# EasyEDA Pro project EtherCAT-RK3506.epro, schematic RK3506, sheets 1 to 5 of 12

## Sheets
1 系统电源图: Board Name: Board1; Create Date: 2026-10-21; Page Name: 系统电源图; Project Name: EtherCAT-RK3506; Schematic Name: Schematic1; Update Date: 2026-10-21; Company: 嘉立创EDA; Page Size: A4; Version: V1.0
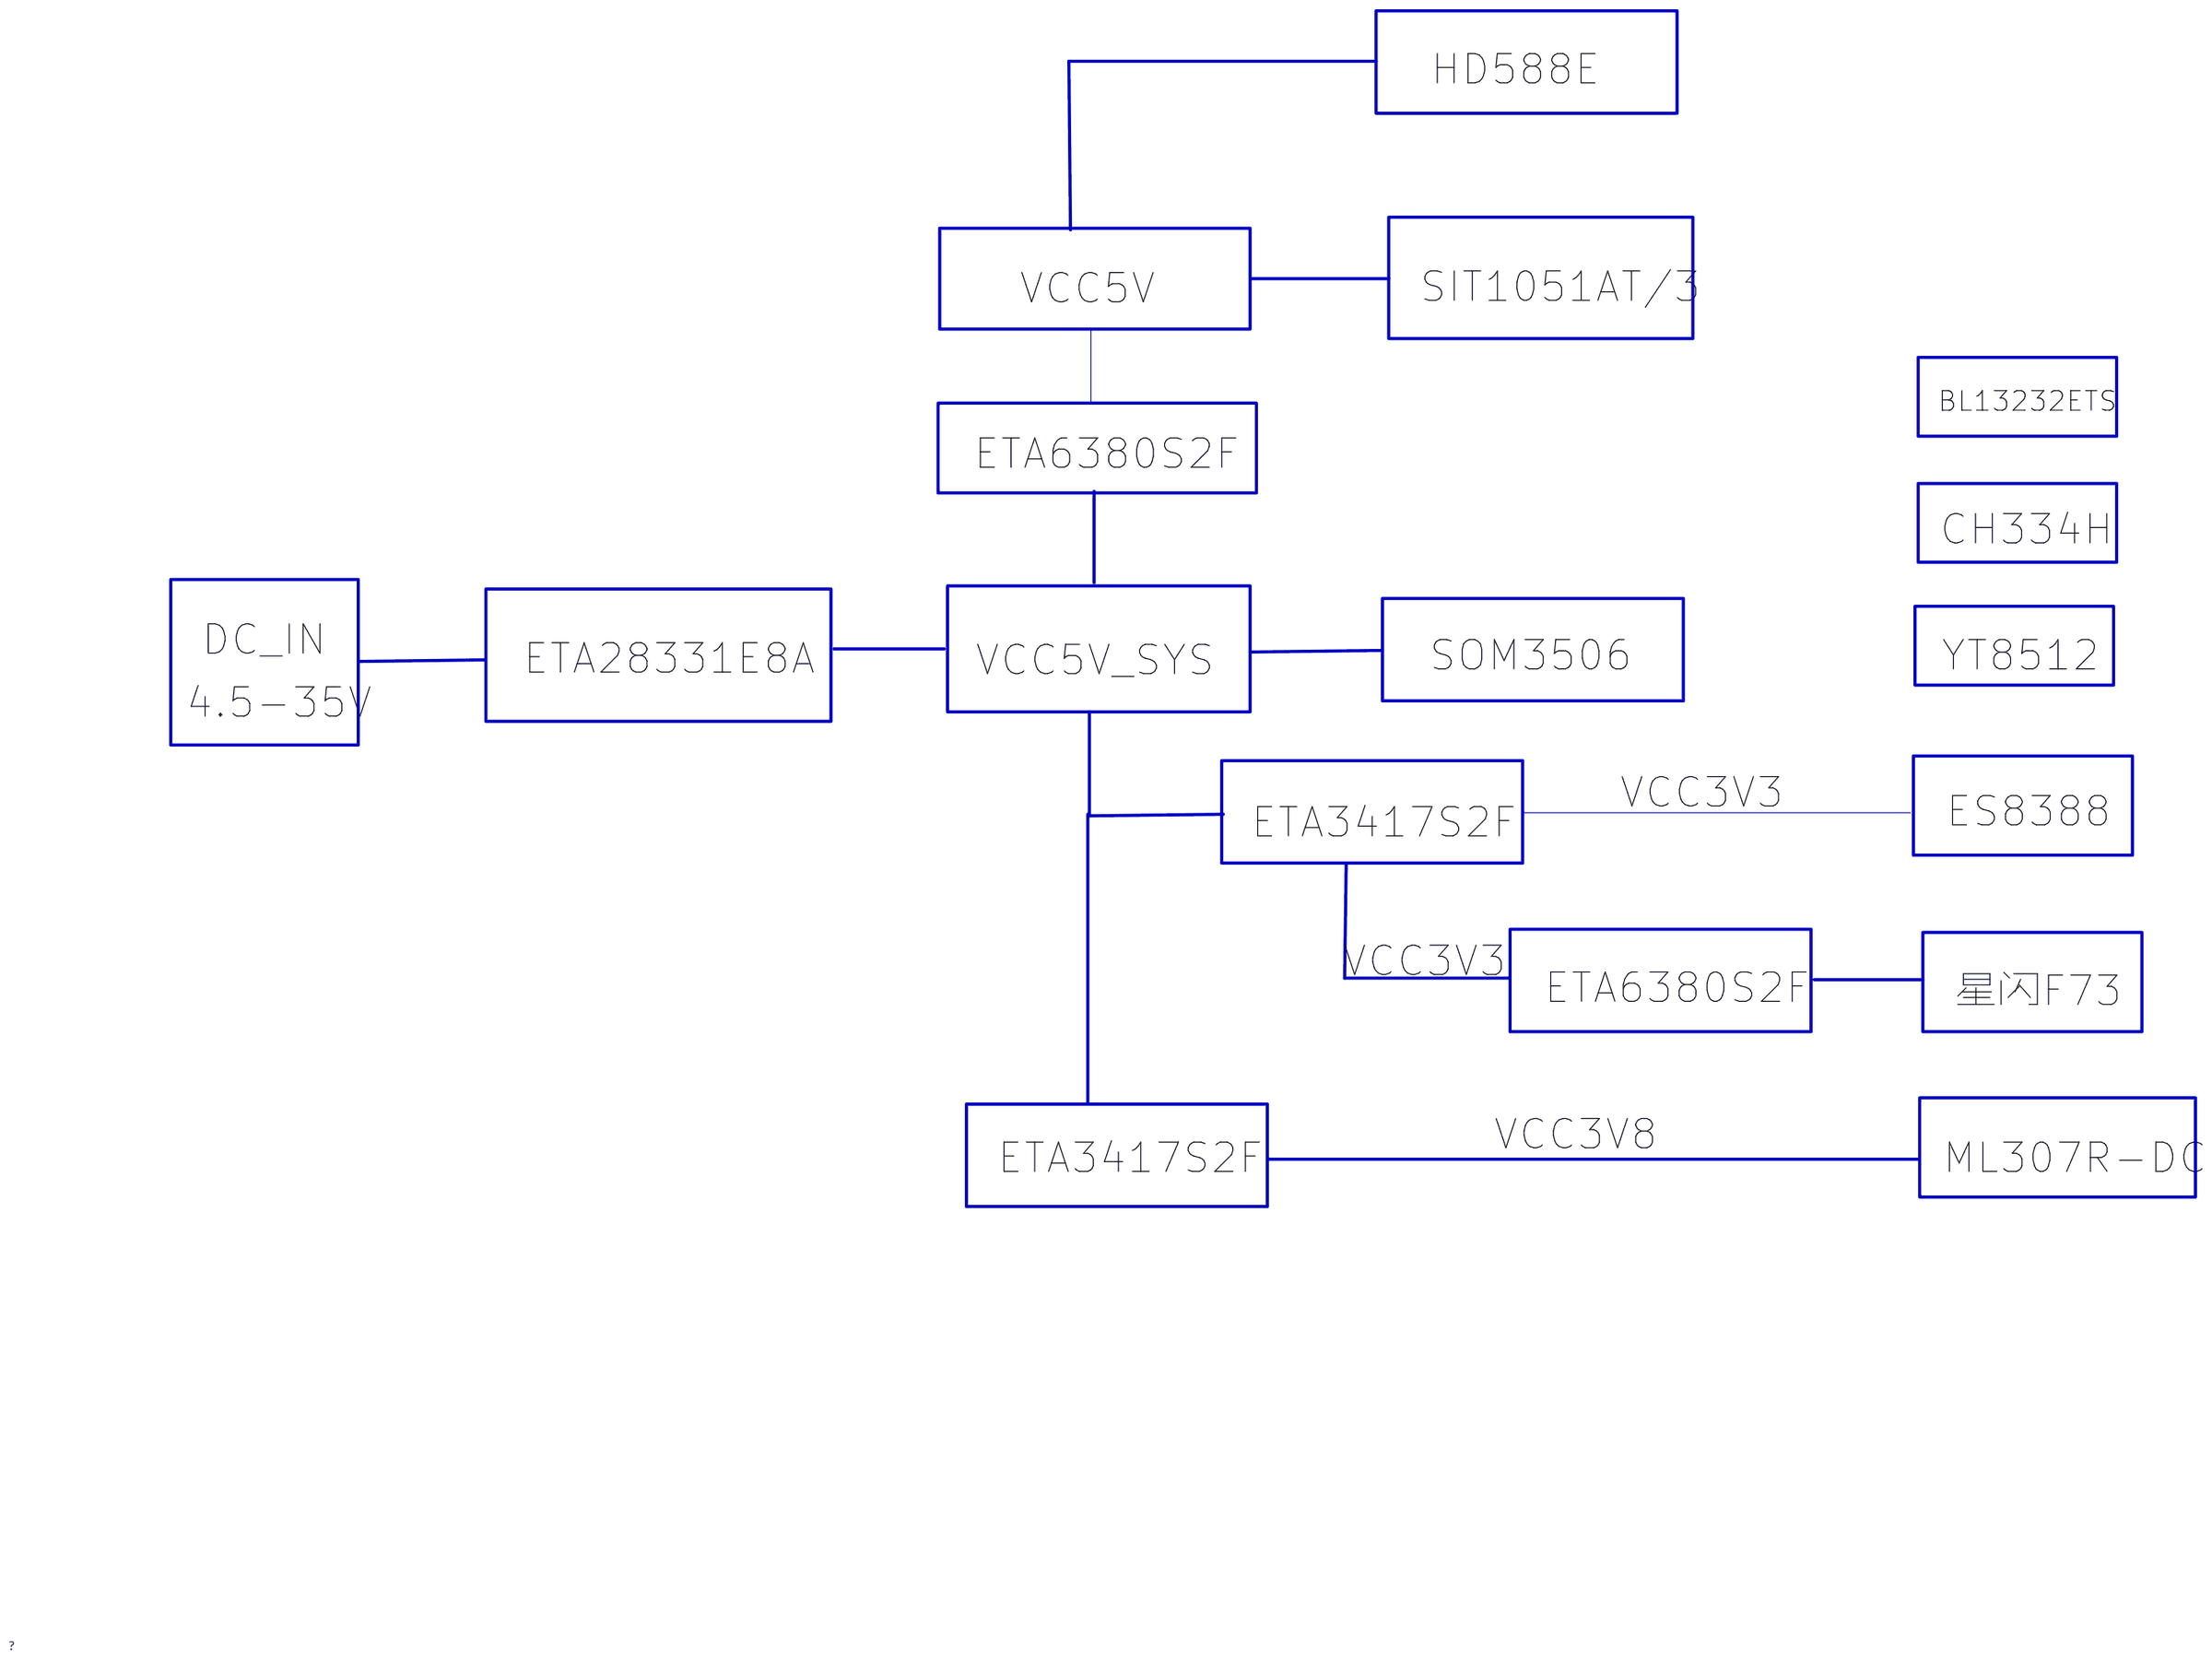
[diagram p0: 系统电源图]
2 系统功能图: Page Name: 系统功能图; Update Date: 2026-10-22
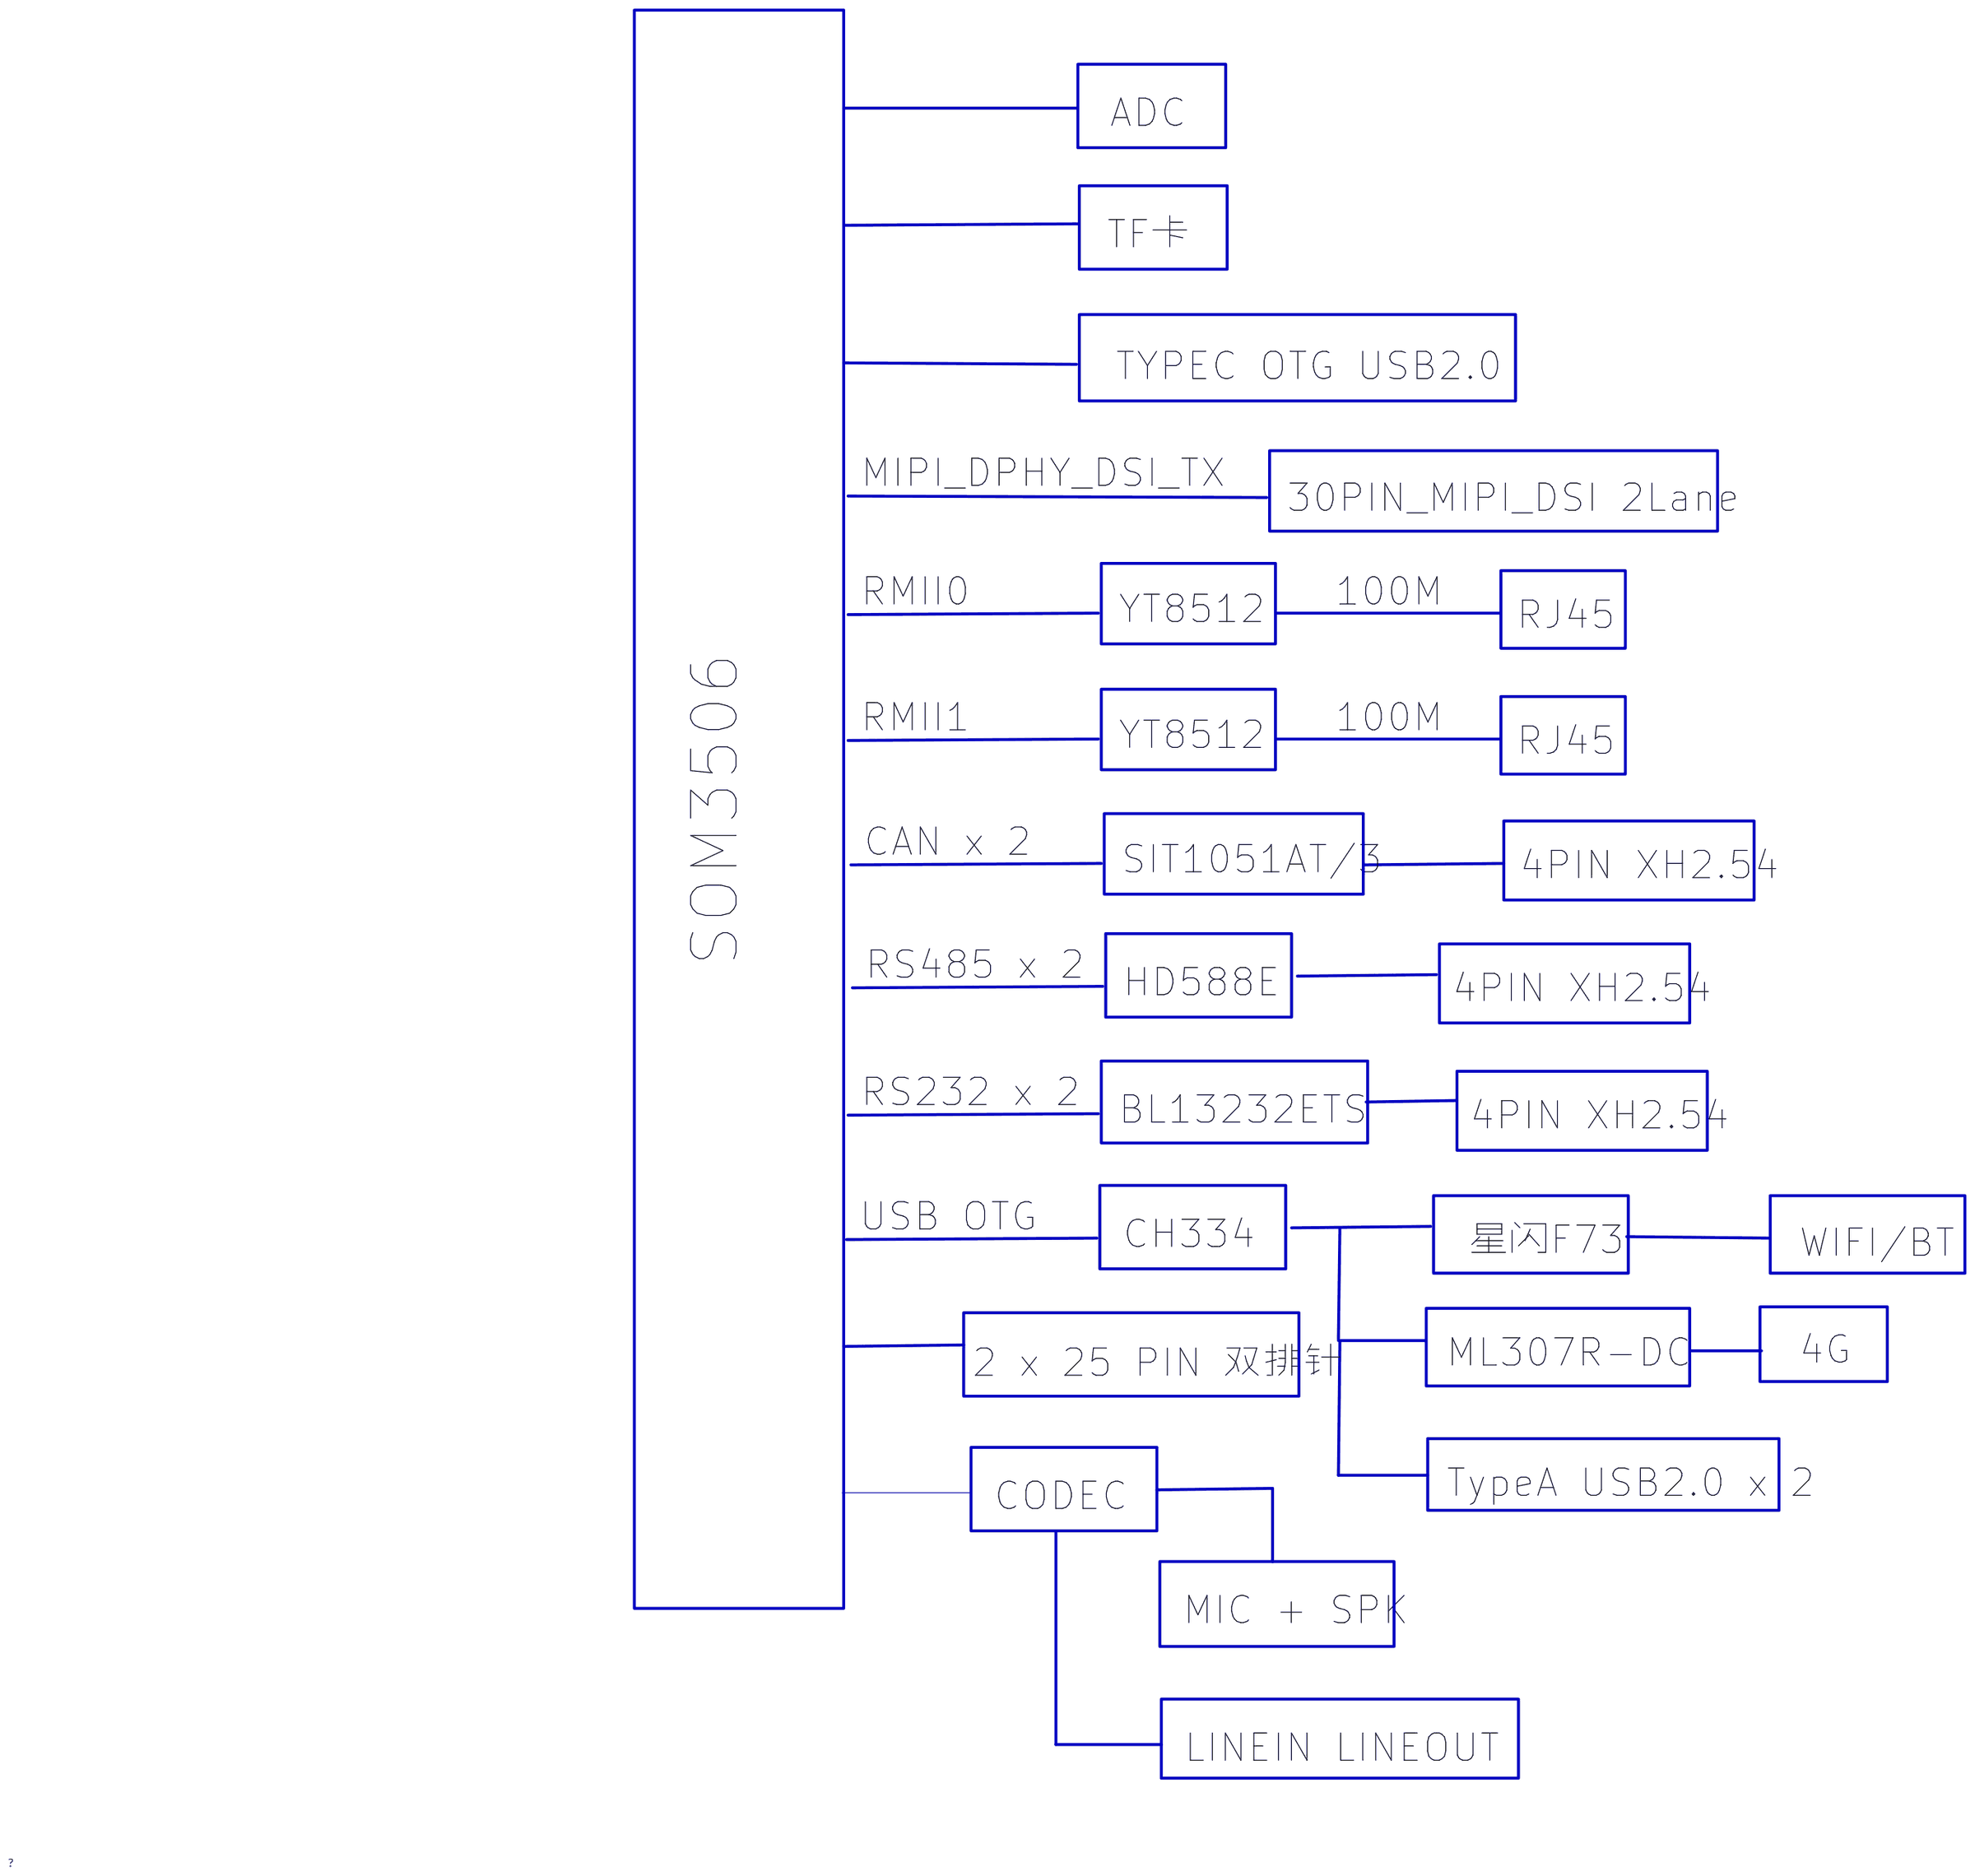
[diagram p1: 系统功能图]
3 电源: Page Name: 电源; Schematic Name: RK3506; Update Date: 2026-10-30
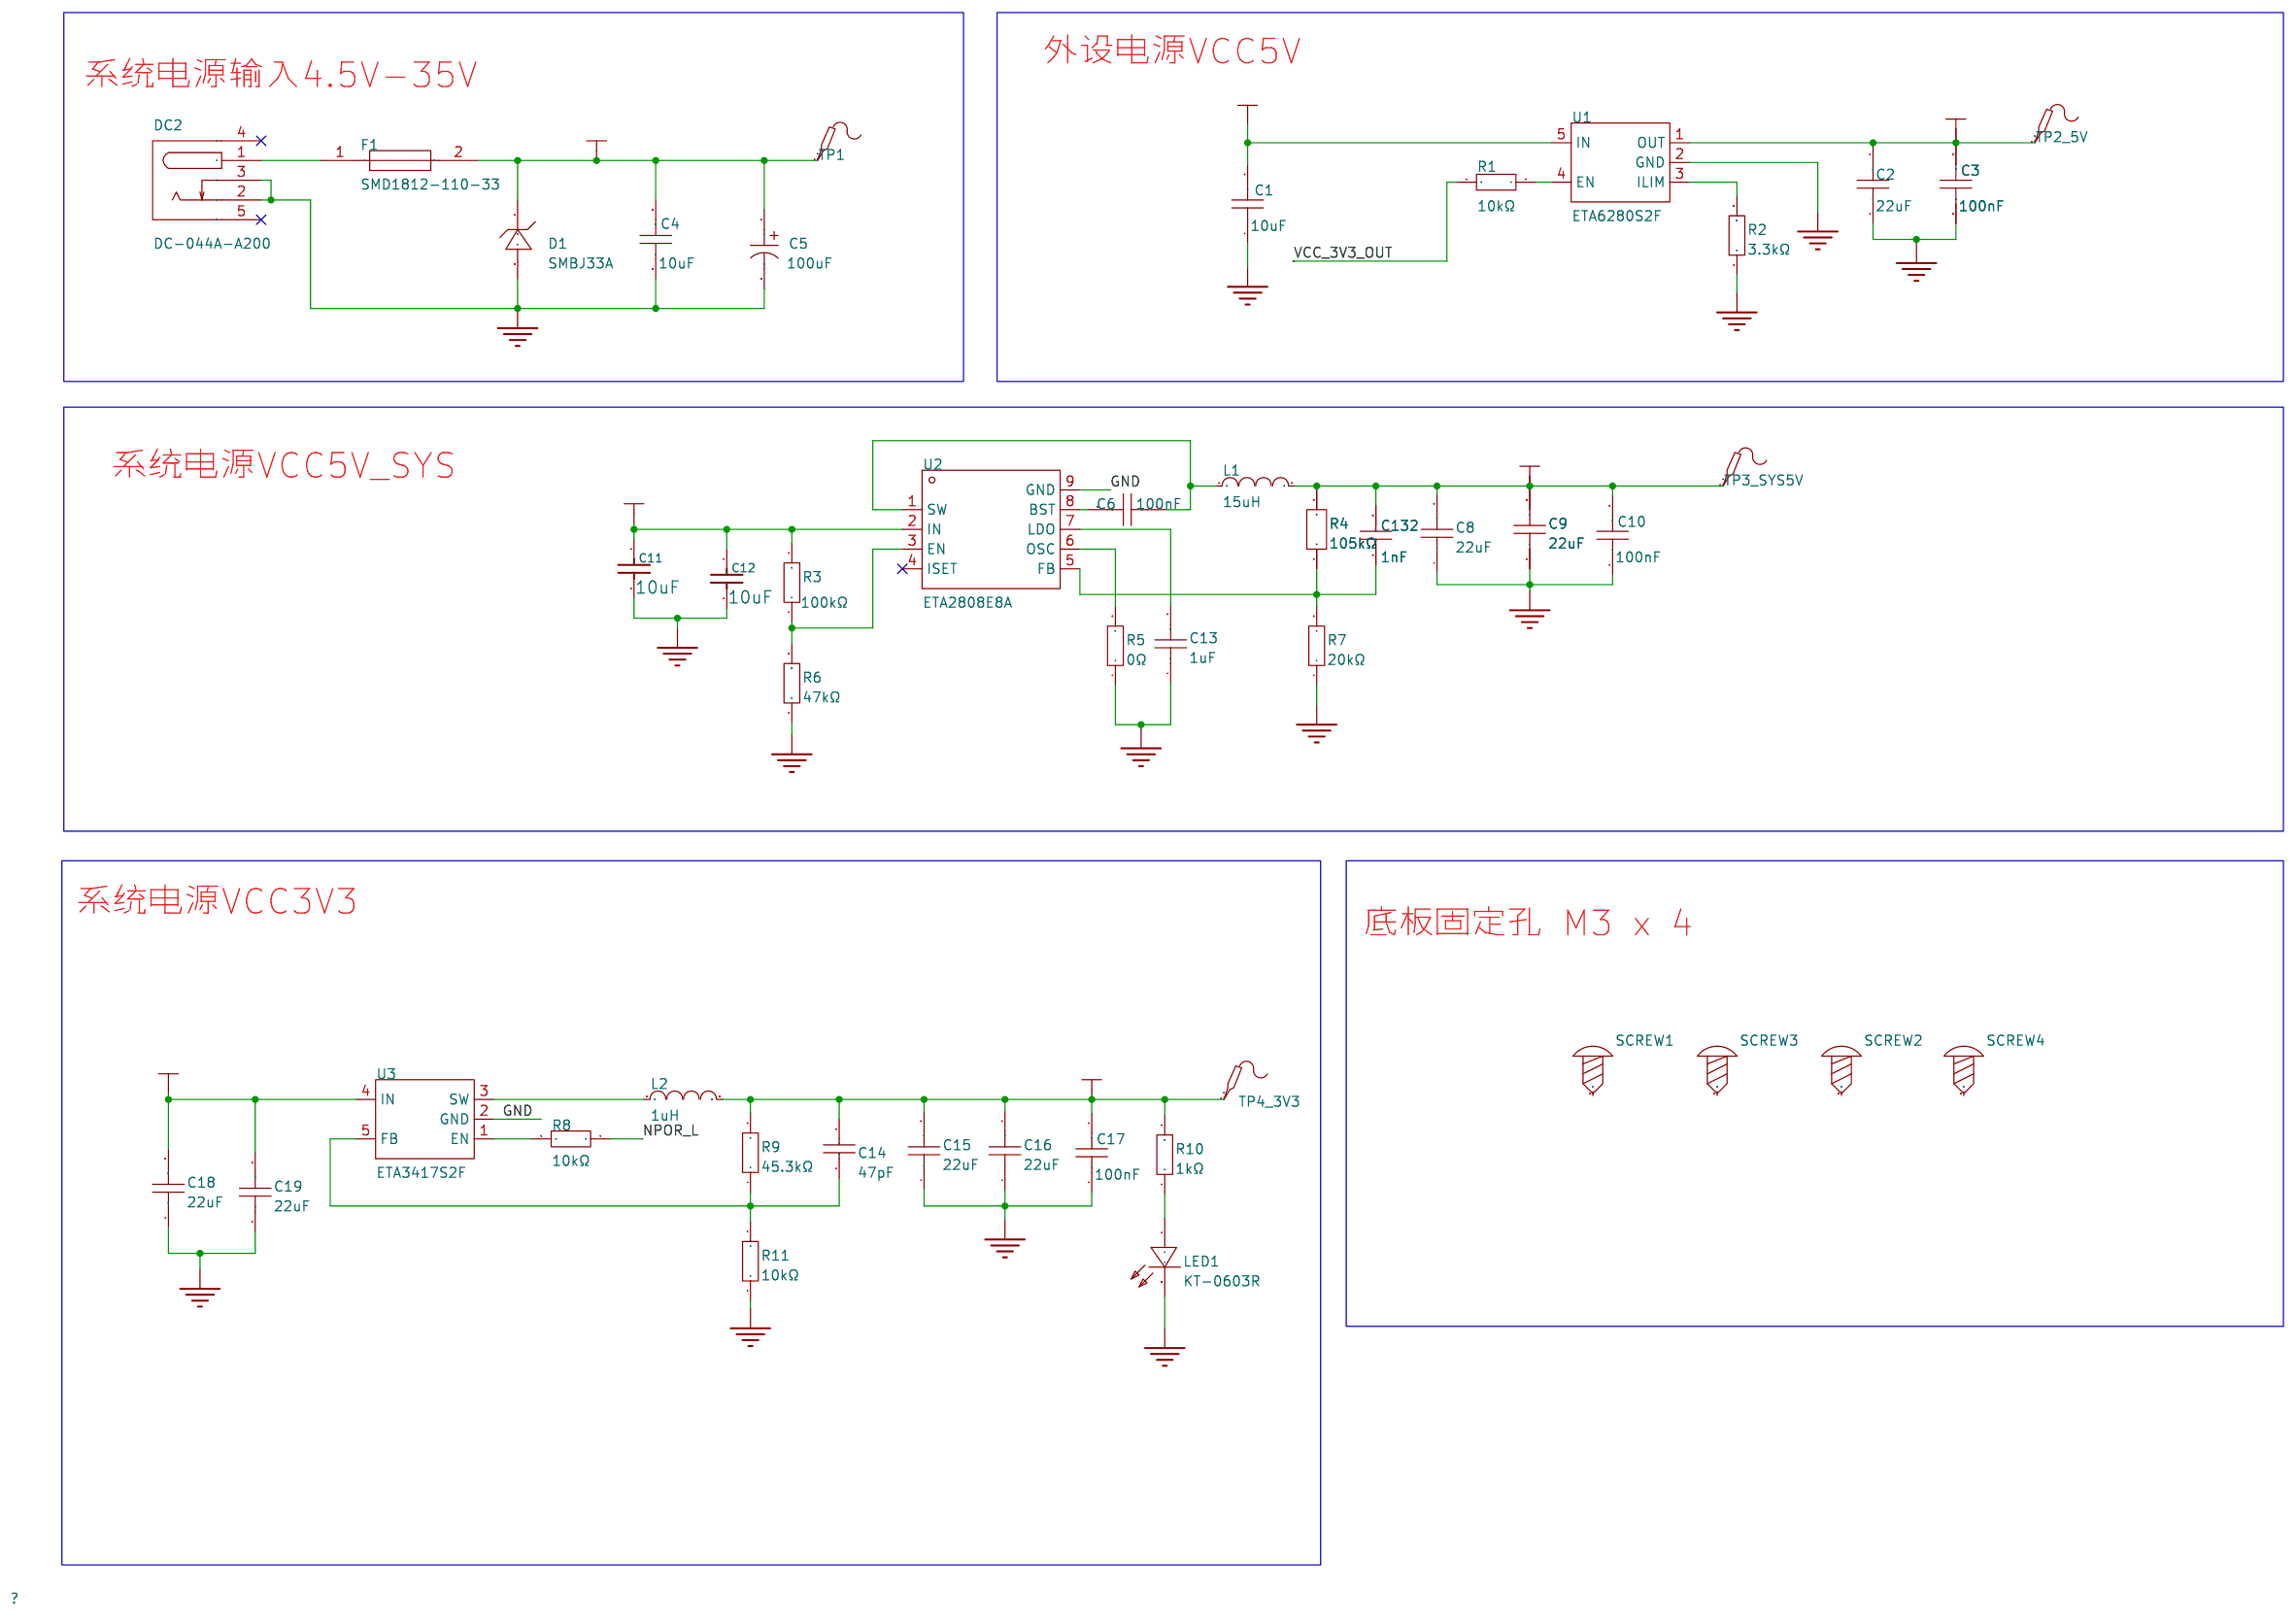
[diagram p2: 电源]
4 核心板: Create Date: 2026-10-22; Page Name: 核心板; Schematic Name: RK3506; Update Date: 2026-10-25
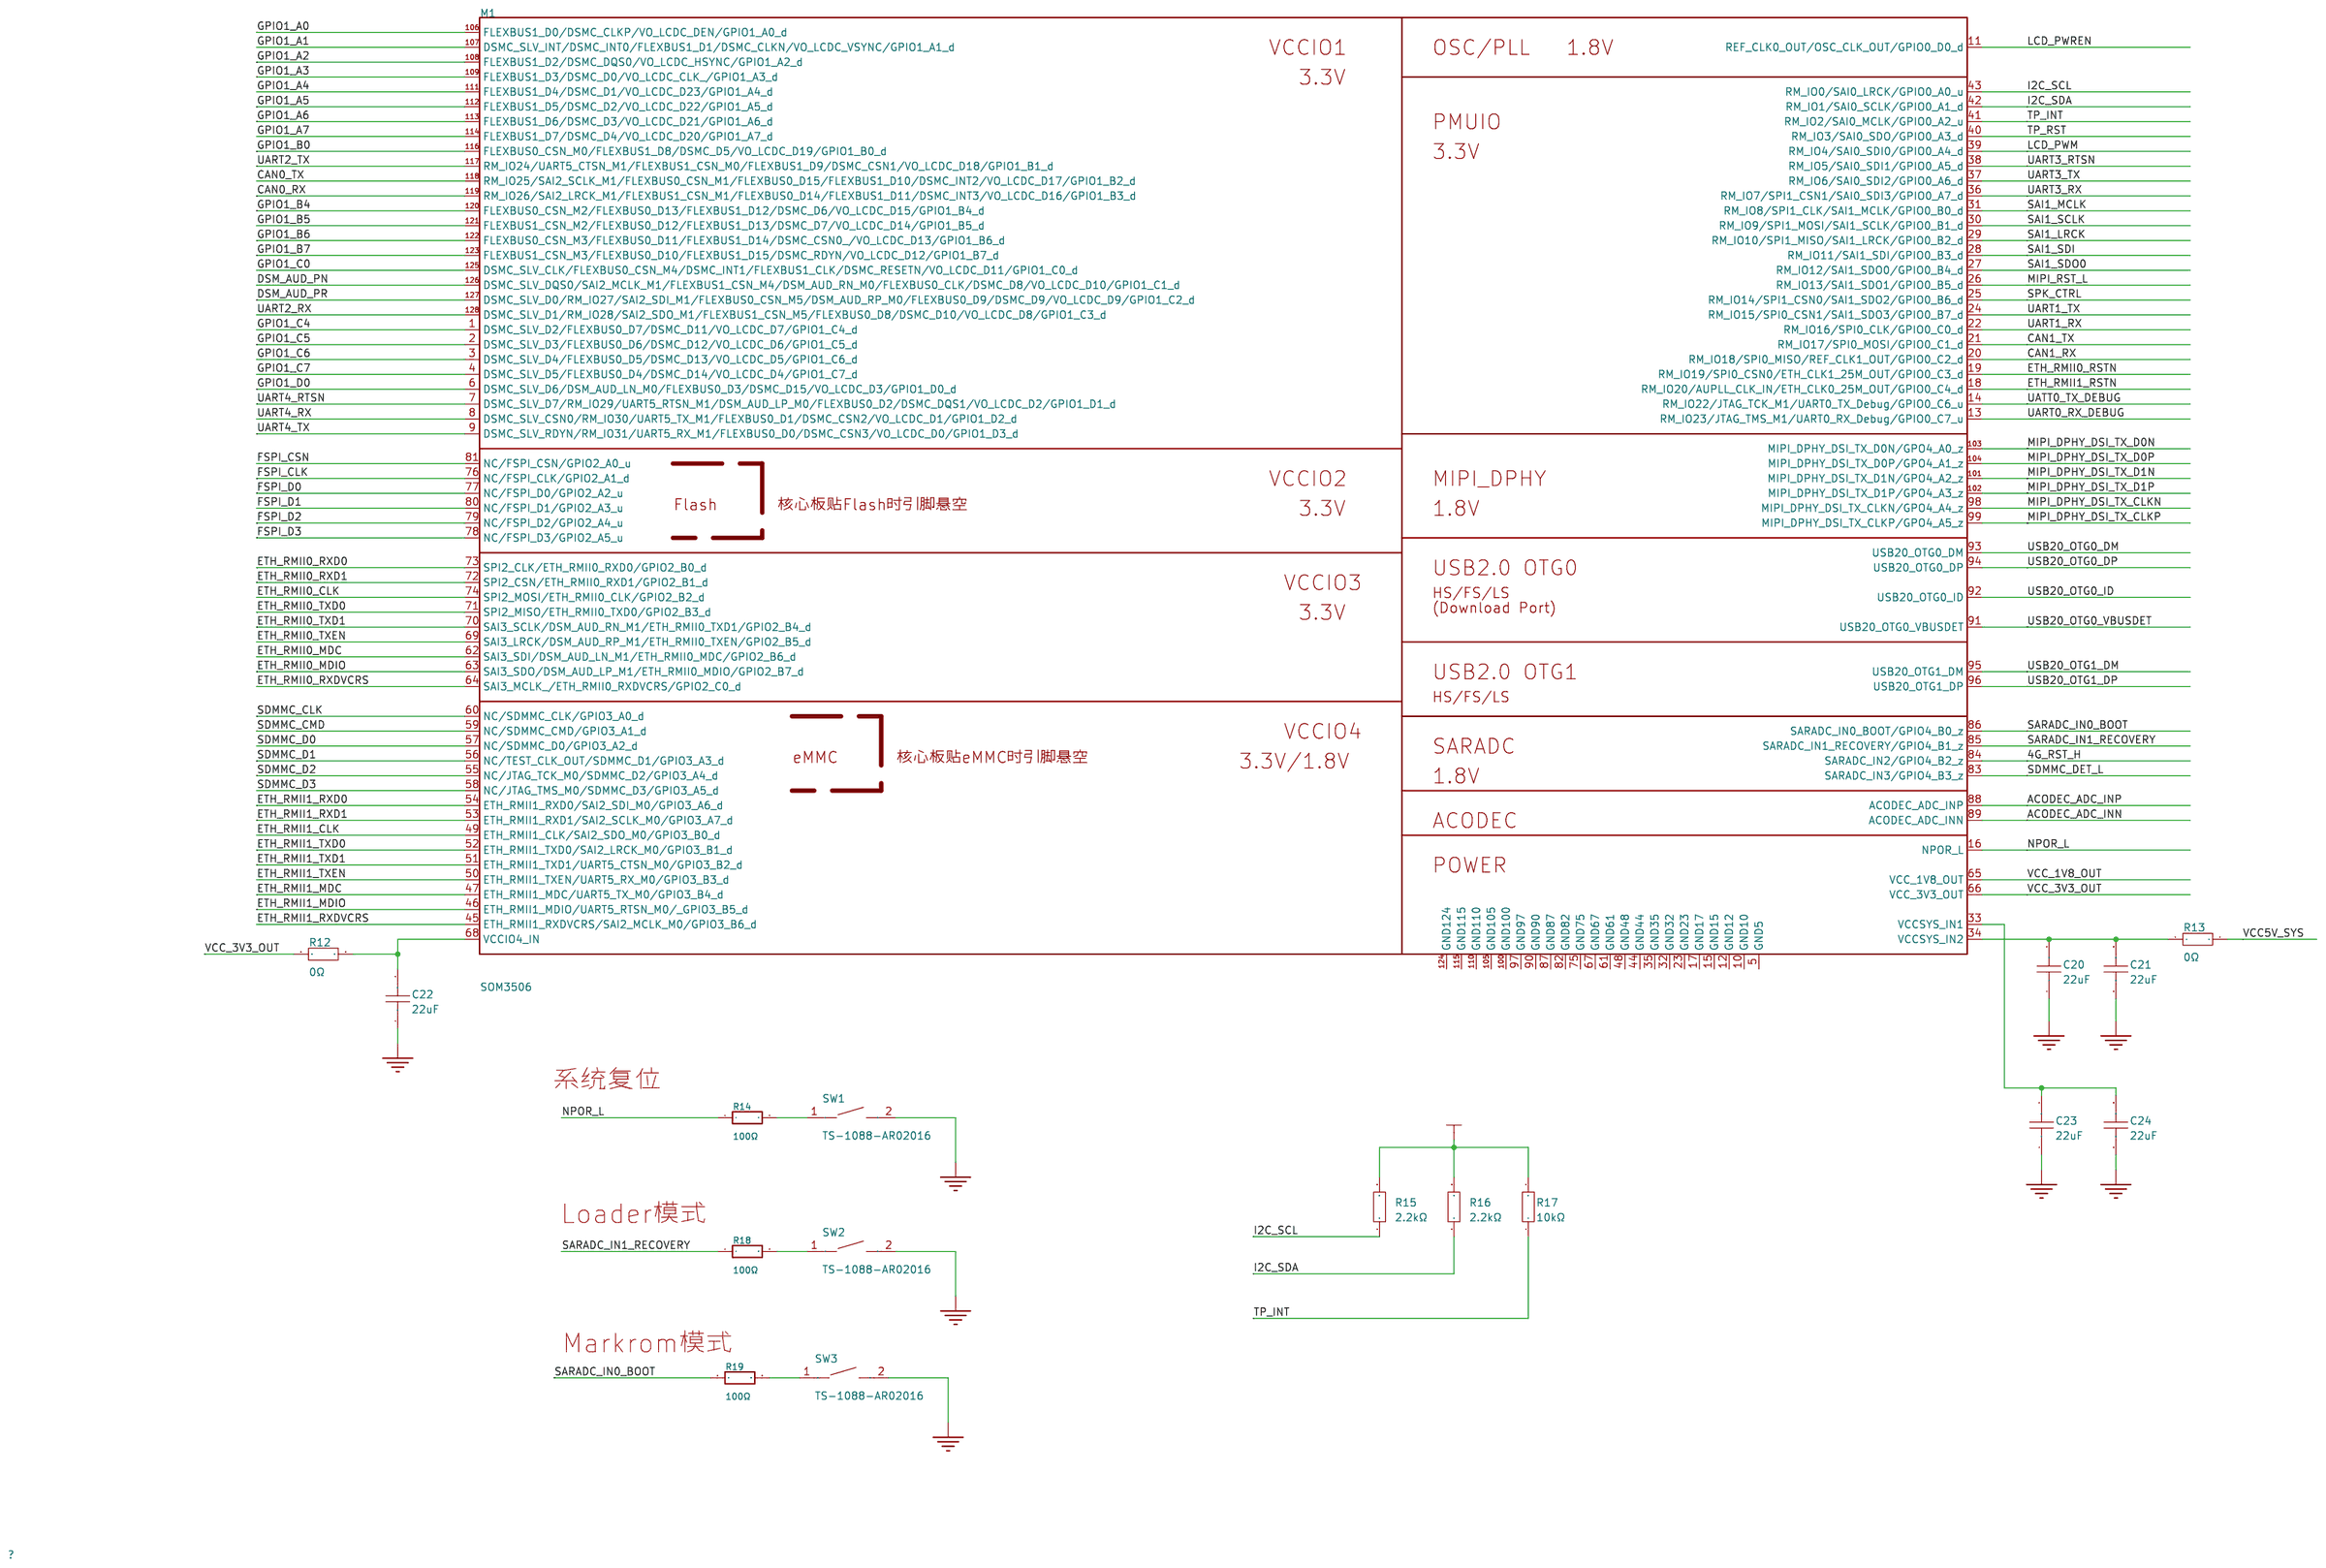
[diagram p3: 核心板]
5 以太网: Create Date: 2026-10-22; Page Name: 以太网; Schematic Name: RK3506; Update Date: 2026-10-28
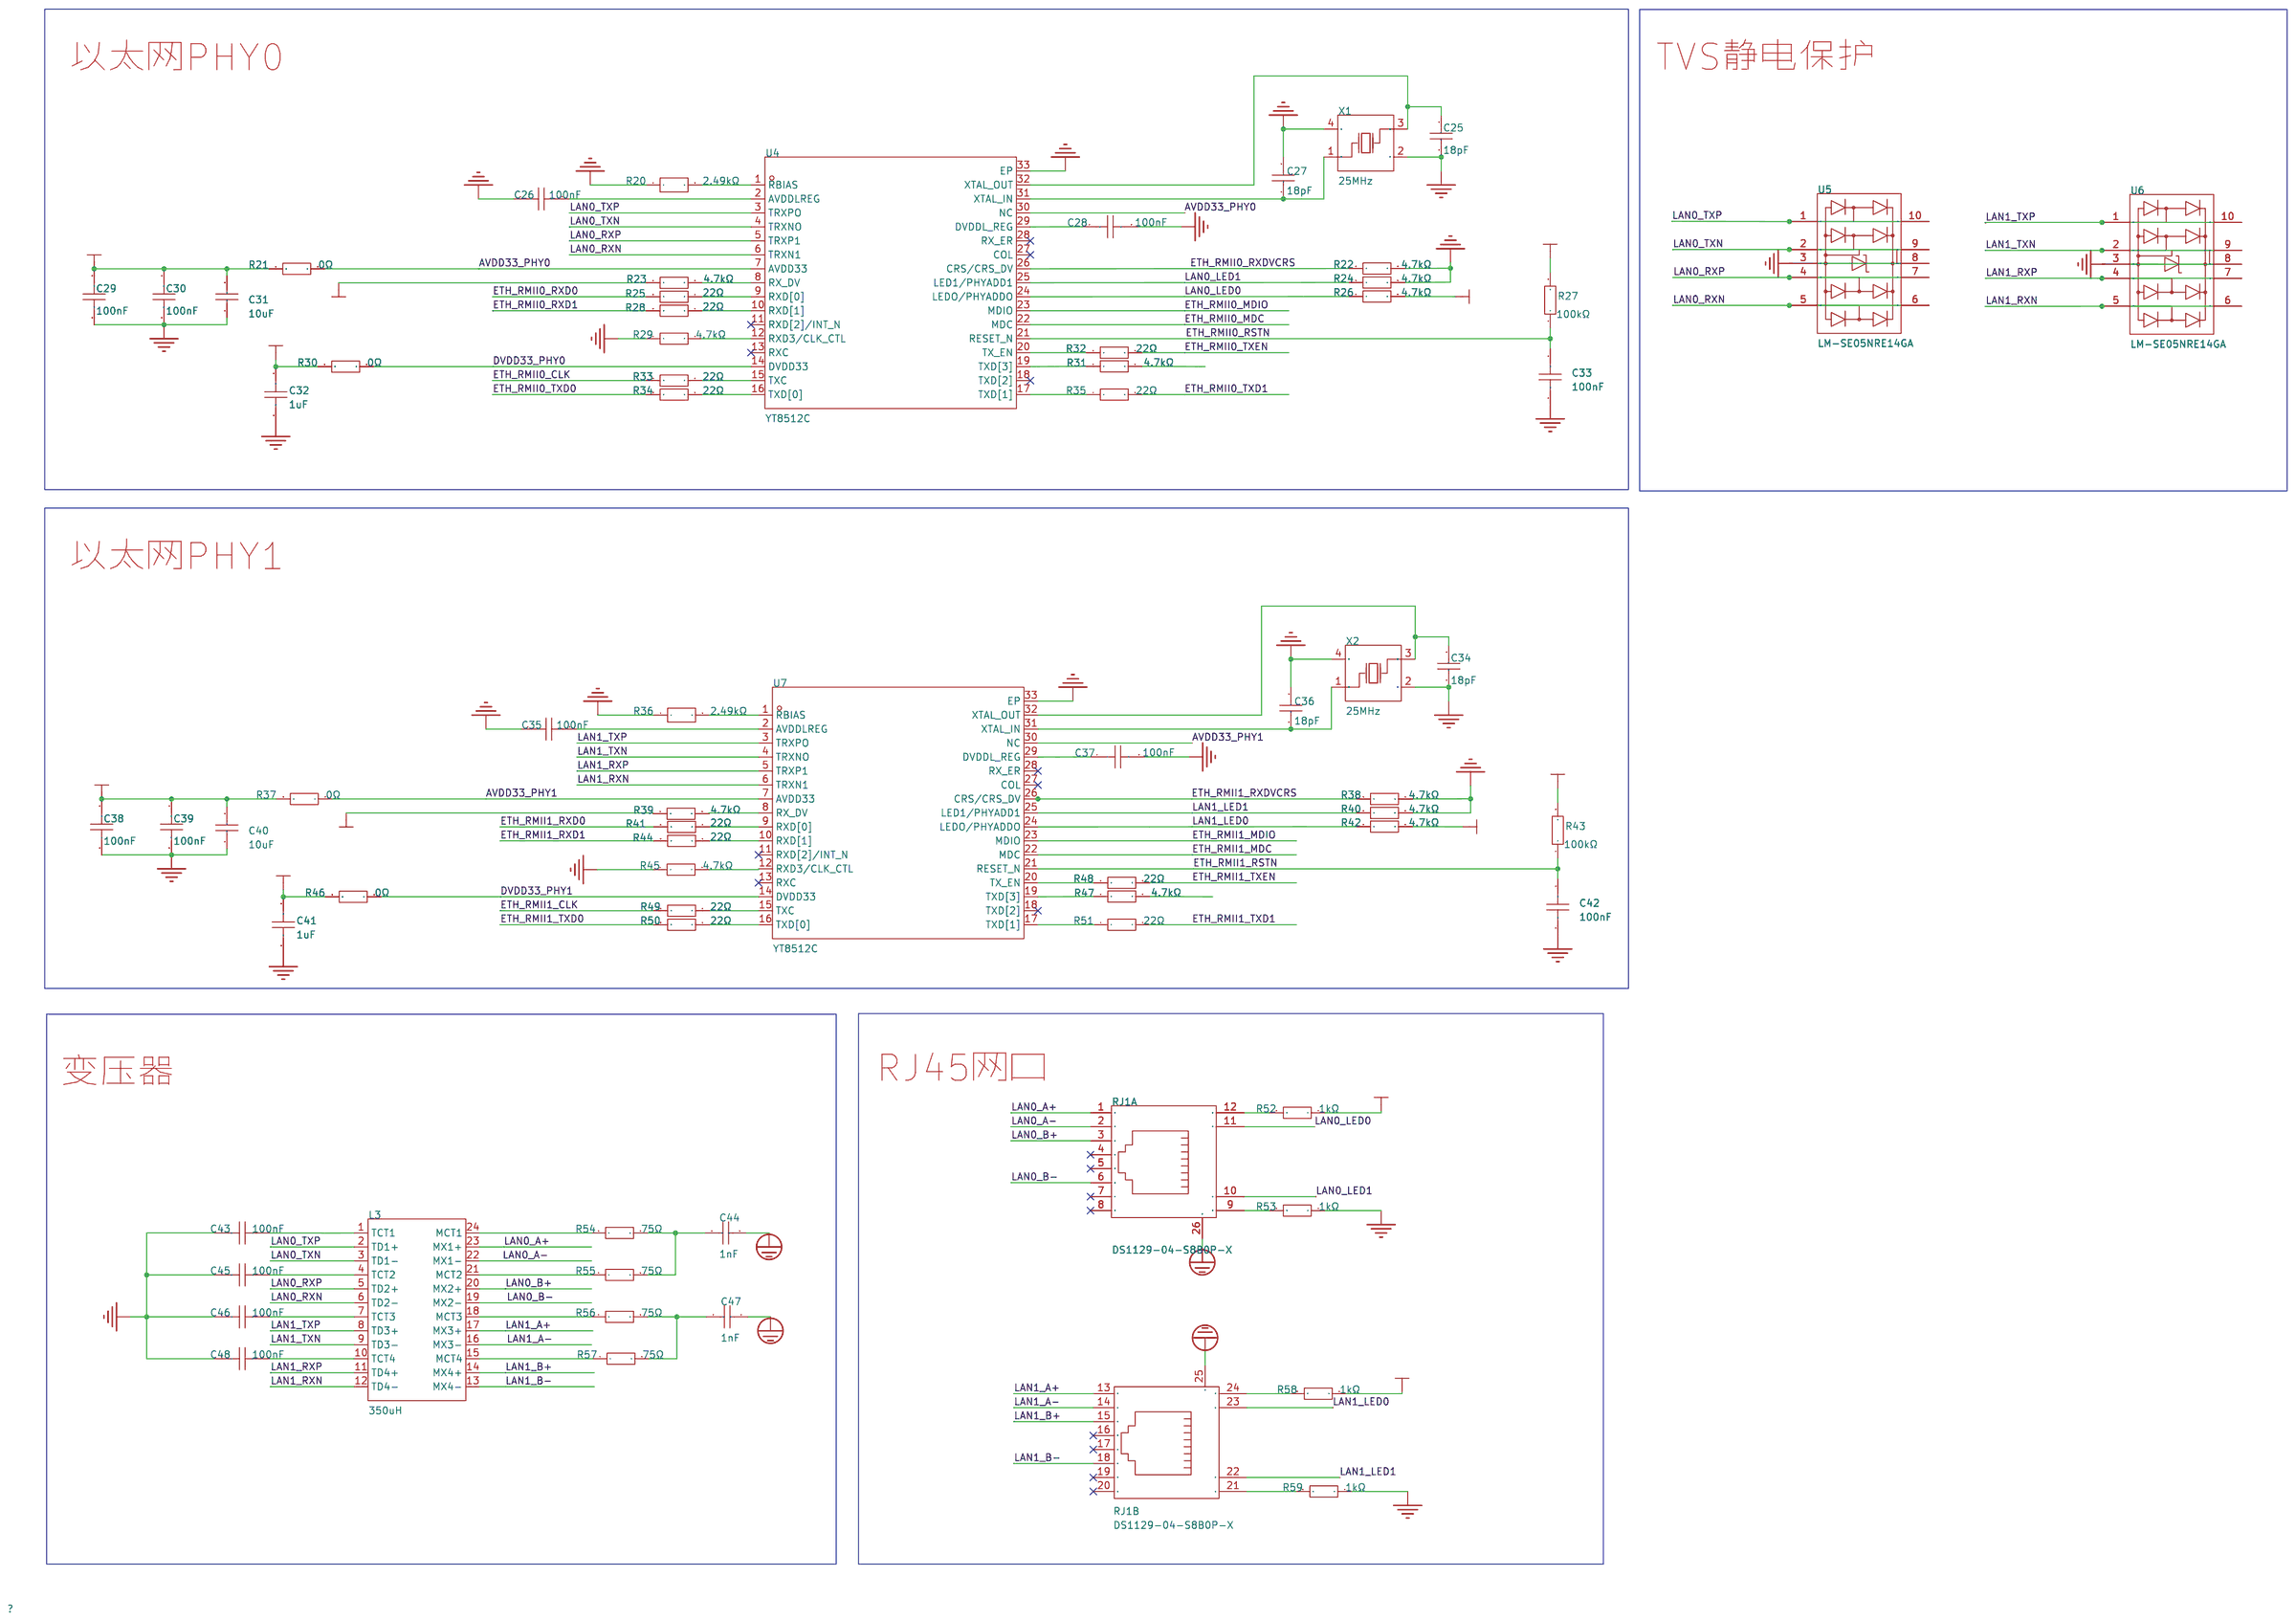
[diagram p4: 以太网]

## Parts
sheet 以太网
C25  18pF  [C0402]
C26  100nF  [C0402]
C27  18pF  [C0402]
C28  100nF  [C0402]
C29  100nF  [C0402]
C30  100nF  [C0402]
C31  10uF  [C0402]
C32  1uF  [C0402]
C33  100nF  [C0402]
C34  18pF  [C0402]
C35  100nF  [C0402]
C36  18pF  [C0402]
C37  100nF  [C0402]
C38  100nF  [C0402]
C39  100nF  [C0402]
C40  10uF  [C0402]
C41  1uF  [C0402]
C42  100nF  [C0402]
C43  100nF  [C0402]
C44  1nF  [C1206]
C45  100nF  [C0402]
C46  100nF  [C0402]
C47  1nF  [C1206]
C48  100nF  [C0402]
L3  350uH  [SMD-24_L15.1-W7.1-P1.00-LS10.0-BL]
R20  2.49kΩ  [R0402]
R21  0Ω  [R0402]
R22  4.7kΩ  [R0402]
R23  4.7kΩ  [R0402]
R24  4.7kΩ  [R0402]
R25  22Ω  [R0402]
R26  4.7kΩ  [R0402]
R27  100kΩ  [R0402]
R28  22Ω  [R0402]
R29  4.7kΩ  [R0402]
R30  0Ω  [R0402]
R31  4.7kΩ  [R0402]
R32  22Ω  [R0402]
R33  22Ω  [R0402]
R34  22Ω  [R0402]
R35  22Ω  [R0402]
R36  2.49kΩ  [R0402]
R37  0Ω  [R0402]
R38  4.7kΩ  [R0402]
R39  4.7kΩ  [R0402]
R40  4.7kΩ  [R0402]
R41  22Ω  [R0402]
R42  4.7kΩ  [R0402]
R43  100kΩ  [R0402]
R44  22Ω  [R0402]
R45  4.7kΩ  [R0402]
R46  0Ω  [R0402]
R47  4.7kΩ  [R0402]
R48  22Ω  [R0402]
R49  22Ω  [R0402]
R50  22Ω  [R0402]
R51  22Ω  [R0402]
R52  1kΩ  [R0402]
R53  1kΩ  [R0402]
R54  75Ω  [R0603]
R55  75Ω  [R0603]
R56  75Ω  [R0603]
R57  75Ω  [R0603]
R58  1kΩ  [R0402]
R59  1kΩ  [R0402]
RJ1  DS1129-04-S8B0P-X  [RJ45-TH_DS1129-04]  (sections 1,2)
U4  YT8512C  [QFN-32_L5.0-W5.0-P0.50-BL-EP3.4]
U5  LM-SE05NRE14GA  [DFN2510-10_L2.5-W1.0-P0.50-BL]
U6  LM-SE05NRE14GA  [DFN2510-10_L2.5-W1.0-P0.50-BL]
U7  YT8512C  [QFN-32_L5.0-W5.0-P0.50-BL-EP3.4]
X1  25MHz  [CRYSTAL-SMD_4P-L3.2-W2.5-BL]
X2  25MHz  [CRYSTAL-SMD_4P-L3.2-W2.5-BL]
sheet 核心板
C20  22uF  [C0402]
C21  22uF  [C0402]
C22  22uF  [C0402]
C23  22uF  [C0402]
C24  22uF  [C0402]
M1  SOM3506  [SOM3506_128P]
R12  0Ω  [R0402]
R13  0Ω  [R0402]
R14  100Ω  [R0402]
R15  2.2kΩ  [R0402]
R16  2.2kΩ  [R0402]
R17  10kΩ  [R0402]
R18  100Ω  [R0402]
R19  100Ω  [R0402]
SW1  TS-1088-AR02016  [SW-SMD_L3.9-W3.0-P4.45]
SW2  TS-1088-AR02016  [SW-SMD_L3.9-W3.0-P4.45]
SW3  TS-1088-AR02016  [SW-SMD_L3.9-W3.0-P4.45]
sheet 电源
C1  10uF  [C0603]
C2  22uF  [C0603]
C3  100nF  [C0402]
C4  10uF  [C1206]
C5  100uF  [CAP-SMD_BD6.3-L6.6-W6.6-RD]
C6  100nF  [C0402]
C8  22uF  [C0402]
C9  22uF  [C0402]
C10  100nF  [C0402]
C11  10uF  [C1206]
C12  10uF  [C1206]
C13  1uF  [C0402]
C14  47pF  [C0402]
C15  22uF  [C0402]
C16  22uF  [C0402]
C17  100nF  [C0402]
C18  22uF  [C0402]
C19  22uF  [C0402]
C132  1nF  [C0402]
D1  SMBJ33A  [SMB_L4.6-W3.6-LS5.3-RD]
DC2  DC-044A-A200  [DC-IN-TH_DC-044A-20A]
F1  SMD1812-110-33  [F1812]
L1  15uH  [IND-SMD_L7.3-W6.8]
L2  1uH  [L0806]
LED1  KT-0603R  [LED-SMD_L1.6-W0.8-R-RD]
R1  10kΩ  [R0402]
R2  3.3kΩ  [R0402]
R3  100kΩ  [R0402]
R4  105kΩ  [R0402]
R5  0Ω  [R0402]
R6  47kΩ  [R0402]
R7  20kΩ  [R0402]
R8  10kΩ  [R0402]
R9  45.3kΩ  [R0402]
R10  1kΩ  [R0402]
R11  10kΩ  [R0402]
SCREW1  -  [M3螺丝]
SCREW2  -  [M3螺丝]
SCREW3  -  [M3螺丝]
SCREW4  -  [M3螺丝]
TP1  -  [Test-Point-0.5mm]
TP2_5V  -  [Test-Point-0.5mm]
TP3_SYS5V  -  [Test-Point-0.5mm]
TP4_3V3  -  [Test-Point-0.5mm]
U1  ETA6280S2F  [SOT-23-5_L3.0-W1.5-P0.95-LS2.8-BL]
U2  ETA2808E8A  [ESOP-8_L4.9-W3.9-P1.27-LS6.0-BL-EP]
U3  ETA3417S2F  [SOT-23-5_L2.9-W1.6-P0.95-LS2.8-BL]

## Library data of the parts
C25 C27 C34 C36 = 0402CG180J500NT: 容值:18pF;精度:±5%;额定电压:50V;温度系数:C0G;; LCSC Part Name: 18pF ±5% 50V; Supplier Part: C1549; Manufacturer: FH(风华); Supplier Footprint: 0402; JLCPCB Part Class: 基础库; Datasheet: https://item.szlcsc.com/datasheet/0402CG180J500NT/1901.html; Supplier: LCSC; Tolerance: ±5%; Voltage Rating: 50V; Temperature Coefficient: C0G
C3 C6 C10 C17 C26 C28-C30 C33 C35 C37-C39 C42 C43 C45 C46 C48 = FCC0402B104K160AT: 容值:100nF;精度:±10%;额定电压:16V;温度系数:X7R;; LCSC Part Name: 100nF ±10% 16V; Supplier Part: C5137468; Manufacturer: FOJAN(富捷); Supplier Footprint: 0402; JLCPCB Part Class: 扩展库; Datasheet: https://item.szlcsc.com/datasheet/FCC0402B104K160AT/5746970.html; Supplier: LCSC; Tolerance: ±10%; Voltage Rating: 16V; Temperature Coefficient: X7R; Operating Temperature: -55℃~+125℃
C31 C40 = CL05A106MQ5NUNC: 容值:10uF;精度:±20%;额定电压:6.3V;温度系数:X5R;; LCSC Part Name: 10uF ±20% 6.3V; Supplier Part: C15525; Manufacturer: SAMSUNG(三星); Supplier Footprint: 0402; JLCPCB Part Class: 基础库; Datasheet: https://item.szlcsc.com/datasheet/CL05A106MQ5NUNC/16204.html; Supplier: LCSC; Tolerance: ±20%; Voltage Rating: 6.3V; Temperature Coefficient: X5R
C13 C32 C41 = CL05A105KA5NQNC: 容值:1uF;精度:±10%;额定电压:25V;温度系数:X5R;; LCSC Part Name: 1uF ±10% 25V; Supplier Part: C52923; Manufacturer: SAMSUNG(三星); Supplier Footprint: 0402; JLCPCB Part Class: 基础库; Datasheet: https://item.szlcsc.com/datasheet/CL05A105KA5NQNC/53938.html; Supplier: LCSC; Tolerance: ±10%; Voltage Rating: 25V; Temperature Coefficient: X5R
C44 C47 = 1206B102K202NT: 容值:1nF;精度:±10%;额定电压:2kV;温度系数:X7R;; LCSC Part Name: 1nF ±10% 2kV; Supplier Part: C9196; Manufacturer: FH(风华); Supplier Footprint: 1206; JLCPCB Part Class: 基础库; Datasheet: https://atta.szlcsc.com/upload/public/pdf/source/20200305/C486355_26A10D38EF8C2A5C37091D0039909270.pdf; Supplier: LCSC; Tolerance: ±10%; Voltage Rating: 2kV; Temperature Coefficient: X7R
L3 = G2406S_C507595: 匝数比:1:1;速率:1000M;端口数量:单口;功能(POE或非POE):-;; LCSC Part Name: 100/1000M单端口变压器模块; Supplier Part: C507595; Manufacturer: CND-tek(磁联达); Manufacturer Part: G2406S; Supplier Footprint: SMD-24P; JLCPCB Part Class: 扩展库; Datasheet: https://item.szlcsc.com/datasheet/G2406S/521247.html; Supplier: LCSC; Turns Ratio: 1:1; rate: 1000M; Number of Channels: 单口; Isolation Voltage(Vrms): 1.5kV; operating temperature: 0℃~+70℃
R20 R36 = FRC0402F2491TS: 电阻类型:厚膜电阻;阻值:2.49kΩ;精度:±1%;功率:62.5mW;工作电压:50V;温度系数:±100ppm/℃;; LCSC Part Name: 2.49kΩ ±1% 62.5mW 厚膜电阻; Supplier Part: C2933083; Manufacturer: FOJAN(富捷); Supplier Footprint: 0402; JLCPCB Part Class: 扩展库; Datasheet: https://item.szlcsc.com/datasheet/FRC0402F2491TS/3279185.html; Supplier: LCSC; Type: 厚膜电阻; Tolerance: ±1%; Power(Watts): 62.5mW; Voltage-Supply(Max): 50V; Temperature Coefficient: ±100ppm/℃; Operating Temperature: -55℃~+155℃
R5 R12 R13 R21 R30 R37 R46 = RC0402JR-070RL: 电阻类型:厚膜电阻;阻值:0Ω;精度:±5%;功率:62.5mW;工作电压:50V;温度系数:-;; LCSC Part Name: 厚膜电阻 0Ω ±5% 62.5mW; Supplier Part: C60485; Manufacturer: YAGEO(国巨); Supplier Footprint: 0402; JLCPCB Part Class: 扩展库; Datasheet: https://item.szlcsc.com/datasheet/RC0402JR-070RL/61537.html; Supplier: LCSC; Type: 厚膜电阻; Tolerance: ±5%; Power(Watts): 62.5mW; Voltage-Supply(Max): 50V; Operating Temperature: -55℃~+155℃
R22-R24 R26 R29 R31 R38-R40 R42 R45 R47 = 0402WGF4701TCE: 电阻类型:厚膜电阻;阻值:4.7kΩ;精度:±1%;功率:62.5mW;工作电压:50V;温度系数:±100ppm/℃;; LCSC Part Name: 厚膜电阻 4.7kΩ ±1%; Supplier Part: C25900; Manufacturer: UNI-ROYAL(厚声); Supplier Footprint: 0402; JLCPCB Part Class: 基础库; Datasheet: https://item.szlcsc.com/datasheet/0402WGF4701TCE/26643.html; Supplier: LCSC; Type: 厚膜电阻; Tolerance: ±1%; Power(Watts): 62.5mW; Voltage-Supply(Max): 50V; Temperature Coefficient: ±100ppm/℃; Operating Temperature: -55℃~+155℃
R25 R28 R32-R35 R41 R44 R48-R51 = 0402WGF220JTCE: 电阻类型:厚膜电阻;阻值:22Ω;精度:±1%;功率:62.5mW;最大工作电压:50V;温度系数:±100ppm/℃;; LCSC Part Name: 22Ω ±1% 62.5mW 厚膜电阻; Supplier Part: C25092; Manufacturer: UNI-ROYAL(厚声); Supplier Footprint: 0402; JLCPCB Part Class: 基础库; Datasheet: https://atta.szlcsc.com/upload/public/pdf/source/20200306/C422600_1E6D84923E4A46A82E41ADD87F860B5C.pdf; Supplier: LCSC; Type: 厚膜电阻; Tolerance: ±1%; Power(Watts): 62.5mW; Overload Voltage (Max): 50V; Temperature Coefficient: ±100ppm/℃; Operating Temperature Range: -55℃~+155℃
R3 R27 R43 = 0402WGF1003TCE: 电阻类型:厚膜电阻;阻值:100kΩ;精度:±1%;功率:62.5mW;工作电压:50V;温度系数:±100ppm/℃;; LCSC Part Name: 厚膜电阻 100kΩ ±1%; Supplier Part: C25741; Manufacturer: UNI-ROYAL(厚声); Supplier Footprint: 0402; JLCPCB Part Class: 基础库; Datasheet: https://item.szlcsc.com/datasheet/0402WGF1003TCE/26484.html; Supplier: LCSC; Type: 厚膜电阻; Tolerance: ±1%; Power(Watts): 62.5mW; Voltage-Supply(Max): 50V; Temperature Coefficient: ±100ppm/℃; Operating Temperature: -55℃~+155℃
R10 R52 R53 R58 R59 = 0402WGF1001TCE: 电阻类型:厚膜电阻;阻值:1kΩ;精度:±1%;功率:62.5mW;工作电压:50V;温度系数:±100ppm/℃;; LCSC Part Name: 厚膜电阻 1kΩ ±1%; Supplier Part: C11702; Manufacturer: UNI-ROYAL(厚声); Supplier Footprint: 0402; JLCPCB Part Class: 基础库; Datasheet: https://item.szlcsc.com/datasheet/0402WGF1001TCE/12256.html; Supplier: LCSC; Type: 厚膜电阻; Tolerance: ±1%; Power(Watts): 62.5mW; Voltage-Supply(Max): 50V; Temperature Coefficient: ±100ppm/℃; Operating Temperature: -55℃~+155℃
R54-R57 = 0603WAF750JT5E: 电阻类型:厚膜电阻;阻值:75Ω;精度:±1%;功率:100mW;工作电压:75V;温度系数:±100ppm/℃;; LCSC Part Name: 厚膜电阻 75Ω ±1%; Supplier Part: C4275; Manufacturer: UNI-ROYAL(厚声); Supplier Footprint: 0603; JLCPCB Part Class: 基础库; Datasheet: https://item.szlcsc.com/datasheet/0603WAF750JT5E/4682.html; Supplier: LCSC; Type: 厚膜电阻; Tolerance: ±1%; Power(Watts): 100mW; Voltage-Supply(Max): 75V; Temperature Coefficient: ±100ppm/℃; Operating Temperature: -55℃~+155℃
RJ1 = DS1129-04-S8B0P-X: 连接器类型:RJ45插座;安装方式:弯插;端口数量:2;LED:带LED;屏蔽:有屏蔽;等级:-;触头材质:铜合金;触头镀层:金;工作温度:-40℃~+85℃;; LCSC Part Name: 弯插 带LED; Supplier Part: C86581; Manufacturer: CONNFLY; Supplier Footprint: 插件; JLCPCB Part Class: 扩展库; Datasheet: https://item.szlcsc.com/datasheet/DS1129-04-S8B0P-X/87758.html; Supplier: LCSC; Connector Type: RJ45插座; Mounting Type: 弯插; Number of Ports: 2; LED: 带LED; Shielding: 有屏蔽; PoE: 不带PoE; Supplementary Features: 鱼叉脚(塑料); Contact Material: 铜合金; Contact Plating: 金; Operating Temperature: -40℃~+85℃; Length: 32.26mm; Width: 15.75mm; Height: 13.1mm
U4 U7 = YT8512C_C2837480: 类型:以太网收发器;端口数量:1;MAC接口:MII；RMII;; LCSC Part Name: 以太网芯片; Supplier Part: C2837480; Manufacturer: Motorcomm(裕太微); Supplier Footprint: QFN-32(5x5); JLCPCB Part Class: 扩展库; Datasheet: https://item.szlcsc.com/datasheet/YT8512C/3009147.html; Supplier: LCSC; Type: 以太网收发器; Number of ports: 1; MAC Interface: MII；RMII; Ethernet Speed Standards: 10BASE-T；100BASE-TX; Data Rate: 10Mbit/s；100Mbit/s; Voltage - Supply: 3.3V; Operating Temperature: 0℃~+70℃; Features: 错误检测与恢复；低功耗模式；可编程LED指示
U5 U6 = LM-SE05NRE14GA: 反向截止电压(Vrwm):5V;钳位电压:15V;击穿电压(VBR):6V;; LCSC Part Name: ESD 5V截止; Supplier Part: C5310700; Manufacturer: Leiditech(雷卯电子); Supplier Footprint: DFN2510-10; JLCPCB Part Class: 扩展库; Datasheet: https://item.szlcsc.com/datasheet/LM-SE05NRE14GA/6066343.html; Supplier: LCSC; Reverse Stand-Off Voltage (Vrwm): 5V; Clamping Voltage: 15V; Voltage - Breakdown: 6V; Reverse Leakage Current (Ir): 100nA; Number of Channels: 四路; level of protection: IEC 61000-4-5；IEC 61000-4-2; Type: ESD; Junction Capacitance: 0.3pF
X1 X2 = X322525MOB4SI: 晶振类型:贴片晶振;频率:25MHz;常温频差:±10ppm;负载电容:12pF;频率稳定度:±20ppm;; LCSC Part Name: YSX321SL 25MHZ 4P 3225 12PF ±10PPM -40~85℃ (±20PPM); Supplier Part: C9006; Manufacturer: YXC(扬兴晶振); Supplier Footprint: SMD3225-4P; JLCPCB Part Class: 基础库; Datasheet: https://item.szlcsc.com/datasheet/X322525MOB4SI/9526.html; Supplier: LCSC; Type: 贴片晶振; Normal temperature Frequency Tolerance: ±10ppm; Load Capacitance: 12pF; Frequency Stability: ±20ppm; Equivalent Series Resistance(ESR): 50Ω; Operating Temperature: -40℃~+85℃
C8 C9 C15 C16 C18-C24 = HGC0402R5226M100NTEJ: 容值:22uF;精度:±20%;额定电压:10V;温度系数:X5R;; LCSC Part Name: 22uF ±20% 10V; Supplier Part: C22367823; Manufacturer: Chinocera(华瓷); Supplier Footprint: 0402; JLCPCB Part Class: 扩展库; Datasheet: https://item.szlcsc.com/datasheet/HGC0402R5226M100NTEJ/23841128.html; Supplier: LCSC; Tolerance: ±20%; Voltage Rating: 10V; Temperature Coefficient: X5R
M1 = SOM3506: PCB Footprint: SOM3506-128P; Origin Footprint 1: SOM3506-128P
R14 R18 R19 = 0402WGF1000TCE: 电阻类型:厚膜电阻;阻值:100Ω;精度:±1%;功率:62.5mW;工作电压:50V;温度系数:±100ppm/℃;; LCSC Part Name: 厚膜电阻 100Ω ±1%; Supplier Part: C25076; Manufacturer: UNI-ROYAL(厚声); Supplier Footprint: 0402; JLCPCB Part Class: 基础库; Datasheet: https://item.szlcsc.com/datasheet/0402WGF1000TCE/25819.html; Supplier: LCSC; Type: 厚膜电阻; Tolerance: ±1%; Power(Watts): 62.5mW; Voltage-Supply(Max): 50V; Temperature Coefficient: ±100ppm/℃; Operating Temperature: -55℃~+155℃
R15 R16 = 0402WGF2201TCE: 电阻类型:厚膜电阻;阻值:2.2kΩ;精度:±1%;功率:62.5mW;工作电压:50V;温度系数:±100ppm/℃;; LCSC Part Name: 厚膜电阻 2.2kΩ ±1%; Supplier Part: C25879; Manufacturer: UNI-ROYAL(厚声); Supplier Footprint: 0402; JLCPCB Part Class: 基础库; Datasheet: https://item.szlcsc.com/datasheet/0402WGF2201TCE/26622.html; Supplier: LCSC; Type: 厚膜电阻; Tolerance: ±1%; Power(Watts): 62.5mW; Voltage-Supply(Max): 50V; Temperature Coefficient: ±100ppm/℃; Operating Temperature: -55℃~+155℃
R1 R8 R11 R17 = 0402WGF1002TCE: 电阻类型:厚膜电阻;阻值:10kΩ;精度:±1%;功率:62.5mW;工作电压:50V;温度系数:±100ppm/℃;; LCSC Part Name: 厚膜电阻 10kΩ ±1%; Supplier Part: C25744; Manufacturer: UNI-ROYAL(厚声); Supplier Footprint: 0402; JLCPCB Part Class: 基础库; Datasheet: https://item.szlcsc.com/datasheet/0402WGF1002TCE/26487.html; Supplier: LCSC; Type: 厚膜电阻; Tolerance: ±1%; Power(Watts): 62.5mW; Voltage-Supply(Max): 50V; Temperature Coefficient: ±100ppm/℃; Operating Temperature: -55℃~+155℃
SW1-SW3 = TS-1088-AR02016: 电路结构:单刀单掷;按钮形状:圆形按钮;作用力:1.6N;安装方式:立贴;开关长度:3.9mm;开关宽度:3mm;开关高度:2mm;带支架:不带支架;触点电流:50mA;额定电压:12V;带灯:-;工作寿命:10万次;; LCSC Part Name: 3.9*3*2mm 立贴 轻触开关; Supplier Part: C720477; Manufacturer: XUNPU(讯普); Supplier Footprint: SMD,4x3mm; JLCPCB Part Class: 基础库; Datasheet: https://item.szlcsc.com/datasheet/TS-1088-AR02016/763484.html; Supplier: LCSC; Circuit: 单刀单掷; Actuator Style: 圆形按钮; Operating Force: 1.6N; Mounting Type: 立贴; Length: 3.9mm; Width: 3mm; Switch Height: 2mm; with Bracket: 不带支架; Contact Current: 50mA; Voltage Rating: 12V; Actuator/Cap Color: 黑色; Termination Style: SMD接片; Life: 10万次; Operating Temperature: -30℃~+80℃
C1 = CL10A106KP8NNNC: 容值:10uF;精度:±10%;额定电压:10V;温度系数:X5R;; LCSC Part Name: 10uF ±10% 10V; Supplier Part: C19702; Manufacturer: SAMSUNG(三星); Supplier Footprint: 0603; JLCPCB Part Class: 基础库; Datasheet: https://item.szlcsc.com/datasheet/CL10A106KP8NNNC/20411.html; Supplier: LCSC; Tolerance: ±10%; Voltage Rating: 10V; Temperature Coefficient: X5R
C2 = CL10A226MQ8NRNC: 容值:22uF;精度:±20%;额定电压:6.3V;温度系数:X5R;; LCSC Part Name: 22uF ±20% 6.3V; Supplier Part: C59461; Manufacturer: SAMSUNG(三星); Supplier Footprint: 0603; JLCPCB Part Class: 基础库; Datasheet: https://item.szlcsc.com/datasheet/CL10A226MQ8NRNC/60514.html; Supplier: LCSC; Tolerance: ±20%; Voltage Rating: 6.3V; Temperature Coefficient: X5R
C4 = FCC1206X106K500HT: 容值:10uF;精度:±10%;额定电压:50V;温度系数:X5R;; LCSC Part Name: 10uF ±10% 50V; Supplier Part: C7467044; Manufacturer: FOJAN(富捷); Supplier Footprint: 1206; JLCPCB Part Class: 扩展库; Datasheet: https://item.szlcsc.com/datasheet/FCC1206X106K500HT/8513631.html; Supplier: LCSC; Tolerance: ±10%; Voltage Rating: 50V; Temperature Coefficient: X5R; Operating Temperature: -55℃~+85℃
C5 = MA35V100M6X8: 容值:100uF;精度:±20%;额定电压:35V;纹波电流:2.9A@100kHz;等效串联电阻(ESR):30mΩ@100kHz;类型:聚合物;; LCSC Part Name: 100uF ±20% 35V; Supplier Part: C46550467; Manufacturer: JIERR(捷而瑞); Supplier Footprint: SMD,D6.3xL7.7mm; JLCPCB Part Class: 扩展库; Datasheet: https://item.szlcsc.com/datasheet/MA35V100M6X8/48680161.html; Supplier: LCSC; Tolerance: ±20%; Voltage Rating: 35V; Ripple Current: 2.9A@100kHz; Equivalent Series Resistance(ESR): 30mΩ@100kHz; Type: 聚合物; Diameter: 6.3mm; Height - Seated (Max): 7mm; Lifetime: 2000hrs@105℃; Operating Temperature: -55℃~+105℃; Polarity type: 有极性
C11 C12 = CL31A106KBHNNNE: 容值:10uF;精度:±10%;额定电压:50V;温度系数:X5R;; LCSC Part Name: 10uF ±10% 50V; Supplier Part: C13585; Manufacturer: SAMSUNG(三星); Supplier Footprint: 1206; JLCPCB Part Class: 基础库; Datasheet: https://item.szlcsc.com/datasheet/CL31A106KBHNNNE/14236.html; Supplier: LCSC; Tolerance: ±10%; Voltage Rating: 50V; Temperature Coefficient: X5R
C14 = 0402CG470J500NT: 容值:47pF;精度:±5%;额定电压:50V;温度系数:C0G;; LCSC Part Name: 47pF ±5% 50V; Supplier Part: C1567; Manufacturer: FH(风华); Supplier Footprint: 0402; JLCPCB Part Class: 基础库; Datasheet: https://item.szlcsc.com/datasheet/0402CG470J500NT/1919.html; Supplier: LCSC; Tolerance: ±5%; Voltage Rating: 50V; Temperature Coefficient: C0G
C132 = 0402B102K500NT: 容值:1nF;精度:±10%;额定电压:50V;温度系数:X7R;; LCSC Part Name: 1nF ±10% 50V; Supplier Part: C1523; Manufacturer: FH(风华); Supplier Footprint: 0402; JLCPCB Part Class: 基础库; Datasheet: https://item.szlcsc.com/datasheet/0402B102K500NT/1875.html; Supplier: LCSC; Tolerance: ±10%; Voltage Rating: 50V; Temperature Coefficient: X7R
D1 = SMBJ33A_C224019: 极性:单向;反向截止电压(Vrwm):33V;钳位电压:53.3V;峰值脉冲电流(Ipp):11.3A@10/1000us;峰值脉冲功率(Ppp):600W@10/1000us;击穿电压(VBR):40.6V;; LCSC Part Name: 单向TVS 33V截止 峰值浪涌电流：11.3A@10/1000us; Supplier Part: C224019; Manufacturer: Littelfuse(美国力特); Supplier Footprint: DO-214AA; JLCPCB Part Class: 扩展库; Datasheet: https://item.szlcsc.com/datasheet/SMBJ33A/224167.html; Supplier: LCSC; Polarity: 单向; Reverse Stand-Off Voltage (Vrwm): 33V; Clamping Voltage: 53.3V; Peak Pulse Current (Ipp): 11.3A@10/1000us; Peak Pulse Power Dissipation (Ppp): 600W@10/1000us; Voltage - Breakdown: 40.6V; Reverse Leakage Current (Ir): 1uA; Number of Channels: 单路; Operating Temperature: -65℃~+150℃; level of protection: IEC 61000-4-4；IEC 61000-4-2; Type: TVS
DC2 = DC-044A-A200: 连接器类型:DC电源插座;安装方式:弯插;触点内径:2mm;触点外径:5.9mm;额定电流:3A;额定电压:30V;工作温度:-20℃~+70℃;; LCSC Part Name: DC电源插座 内径:2mm 外径:5.9mm; Supplier Part: C720575; Manufacturer: XUNPU(讯普); Supplier Footprint: 插件; JLCPCB Part Class: 扩展库; Datasheet: https://item.szlcsc.com/datasheet/DC-044A-A200/763582.html; Supplier: LCSC; Connector Type: DC电源插座; Mounting Type: 弯插; Inside Contact Diameter: 2mm; Outside Contact Diameter: 5.9mm; Current Rating: 3A; Voltage Rating (Max): 30V; Body Height: 7.2mm; Length: 11.7mm; Width: 9.93mm; Operating Temperature: -20℃~+70℃
F1 = SMD1812-110-33: 耐压(Vmax):33V;最大电流(Imax):40A;保持电流(Ihold):1.1A;跳闸电流(Itrip):2.2A;; LCSC Part Name: 33V 1.1A; Supplier Part: C46641155; Manufacturer: R+O(宏嘉诚); Supplier Footprint: 1812; JLCPCB Part Class: 扩展库; Datasheet: https://item.szlcsc.com/datasheet/SMD1812-110-33/48798761.html; Supplier: LCSC; Voltage - Max: 33V; Current - Max: 40A; Hold Current: 1.1A; Trip Current: 2.2A; Power Dissipation: 1W; Resistance - Initial (Ri) (Min): 45mΩ; Resistance - Post Trip (R1) (Max): 250mΩ; Time to Trip(Max): 300ms; Operating Temperature: -40℃~+85℃; Length: 4.73mm; Width: 3.41mm; Height: 1.3mm
L1 = MWSA0603S-150MT: 电感值:15uH;精度:±20%;额定电流:3A;饱和电流(Isat):4A;类型:-;; LCSC Part Name: 15uH ±20% 4A; Supplier Part: C408452; Manufacturer: Sunlord(顺络); Supplier Footprint: SMD,7x6.6mm; JLCPCB Part Class: 扩展库; Datasheet: https://atta.szlcsc.com/upload/public/pdf/source/20241120/C3046DCB1C3F2309EE367F9FCC48E933.pdf; Supplier: LCSC; Tolerance: ±20%; Rated Current: 3A; Current - Saturation(Isat): 4A; DC Resistance(DCR): 113mΩ
L2 = DFE201612E-1R0M=P2: 电感值:1uH;精度:±20%;额定电流:2.9A;饱和电流(Isat):4A;类型:-;; LCSC Part Name: 1uH ±20% 4A; Supplier Part: C337892; Manufacturer: muRata(村田); Supplier Footprint: 0806; JLCPCB Part Class: 扩展库; Datasheet: https://item.szlcsc.com/datasheet/DFE201612E-1R0M%253DP2/315672.html; Supplier: LCSC; Tolerance: ±20%; Current Rating: 2.9A; Current - Saturation(Isat): 4A; DC Resistance(DCR): 48mΩ
LED1 = KT-0603R: 灯头类型:1.6mmx0.8mm方形灯头;发光颜色:红色;正向压降(Vf):1.8V~2.4V;功率:40mW;正向电流:20mA;波长:615nm~630nm;二极管配置:独立二极管;透镜颜色:无色透明透镜;色温:-;发光强度:300mcd;发光角度:120°;载带方式:-;工作温度:-40℃~+85℃;; LCSC Part Name: 0603 红灯 高亮; Supplier Part: C2286; Manufacturer: KENTO; Supplier Footprint: 0603; JLCPCB Part Class: 基础库; Datasheet: https://item.szlcsc.com/datasheet/KT-0603R/2659.html; Supplier: LCSC; Lamp Holder Type: 1.6mmx0.8mm方形灯头; Illumination Color: 红色; Voltage - Forward(Vf): 1.8V~2.4V; Power(Watts): 40mW; Forward Current: 20mA; Wavelength - Dominant: 615nm~630nm; Peak Wavelength: 645nm; Diode Configuration: 独立二极管; Lens Color: 无色透明透镜; Luminous Intensity: 300mcd; Viewing Angle: 120°; Operating Temperature: -40℃~+85℃
R2 = 0402WGF3301TCE: 电阻类型:厚膜电阻;阻值:3.3kΩ;精度:±1%;功率:62.5mW;工作电压:50V;温度系数:±100ppm/℃;; LCSC Part Name: 厚膜电阻 3.3kΩ ±1%; Supplier Part: C25890; Manufacturer: UNI-ROYAL(厚声); Supplier Footprint: 0402; JLCPCB Part Class: 基础库; Datasheet: https://item.szlcsc.com/datasheet/0402WGF3301TCE/26633.html; Supplier: LCSC; Type: 厚膜电阻; Tolerance: ±1%; Power(Watts): 62.5mW; Voltage-Supply(Max): 50V; Temperature Coefficient: ±100ppm/℃; Operating Temperature: -55℃~+155℃
R4 = FRC0402F1053TS: 电阻类型:厚膜电阻;阻值:105kΩ;精度:±1%;功率:62.5mW;工作电压:50V;温度系数:±100ppm/℃;; LCSC Part Name: 105kΩ ±1% 62.5mW 厚膜电阻; Supplier Part: C2933067; Manufacturer: FOJAN(富捷); Supplier Footprint: 0402; JLCPCB Part Class: 扩展库; Datasheet: https://item.szlcsc.com/datasheet/FRC0402F1053TS/3279169.html; Supplier: LCSC; Type: 厚膜电阻; Tolerance: ±1%; Power(Watts): 62.5mW; Voltage-Supply(Max): 50V; Temperature Coefficient: ±100ppm/℃; Operating Temperature: -55℃~+155℃
R6 = 0402WGF4702TCE: 电阻类型:厚膜电阻;阻值:47kΩ;精度:±1%;功率:62.5mW;工作电压:50V;温度系数:±100ppm/℃;; LCSC Part Name: 厚膜电阻 47kΩ ±1%; Supplier Part: C25792; Manufacturer: UNI-ROYAL(厚声); Supplier Footprint: 0402; JLCPCB Part Class: 基础库; Datasheet: https://item.szlcsc.com/datasheet/0402WGF4702TCE/26535.html; Supplier: LCSC; Type: 厚膜电阻; Tolerance: ±1%; Power(Watts): 62.5mW; Voltage-Supply(Max): 50V; Temperature Coefficient: ±100ppm/℃; Operating Temperature: -55℃~+155℃
R7 = 0402WGF2002TCE: 电阻类型:厚膜电阻;阻值:20kΩ;精度:±1%;功率:62.5mW;最大工作电压:50V;温度系数:±100ppm/℃;; LCSC Part Name: 20kΩ ±1% 62.5mW 厚膜电阻; Supplier Part: C25765; Manufacturer: UNI-ROYAL(厚声); Supplier Footprint: 0402; JLCPCB Part Class: 基础库; Datasheet: https://atta.szlcsc.com/upload/public/pdf/source/20200306/C422600_1E6D84923E4A46A82E41ADD87F860B5C.pdf; Supplier: LCSC; Type: 厚膜电阻; Tolerance: ±1%; Power(Watts): 62.5mW; Overload Voltage (Max): 50V; Temperature Coefficient: ±100ppm/℃; Operating Temperature Range: -55℃~+155℃
R9 = RC0402FR-0745K3L: 电阻类型:厚膜电阻;阻值:45.3kΩ;精度:±1%;功率:62.5mW;工作电压:50V;温度系数:±100ppm/℃;; LCSC Part Name: 厚膜电阻 45.3kΩ ±1% 62.5mW; Supplier Part: C137977; Manufacturer: YAGEO(国巨); Supplier Footprint: 0402; JLCPCB Part Class: 扩展库; Datasheet: https://item.szlcsc.com/datasheet/RC0402FR-0745K3L/149293.html; Supplier: LCSC; Type: 厚膜电阻; Tolerance: ±1%; Power(Watts): 62.5mW; Voltage-Supply(Max): 50V; Temperature Coefficient: ±100ppm/℃; Operating Temperature: -55℃~+155℃
SCREW1-SCREW4 = M3螺丝: Supplier Footprint: 插件
TP1 TP2_5V TP3_SYS5V TP4_3V3 = Test-Point: Test Point 测试点
U1 = ETA6280S2F: 类型:负载开关;通道数:1;输入控制逻辑:高电平有效;工作电压:2.1V~6V;最大连续电流:2.2A;导通电阻:70mΩ;; LCSC Part Name: 可编程电流限制负载开关; Supplier Part: C7465543; Manufacturer: ETA(钰泰); Supplier Footprint: SOT23-5; JLCPCB Part Class: 扩展库; Datasheet: https://item.szlcsc.com/datasheet/ETA6280S2F/8507080.html; Supplier: LCSC; Type: 负载开关; Number of Channels: 1; Control Input Logic: 高电平有效; Voltage - Supply: 2.1V~6V; Maximum Continuous Current: 2.2A; RDS(on): 70mΩ; Features: 过温保护；过流保护；短路保护；反向电流阻断；输出放电功能；过压保护；欠压锁定; Operating Temperature	-: -40℃~+85℃
U2 = ETA2808E8A: 功能类型:降压型;工作电压:4.6V~35V;输出电压:800mV~35V;输出电流:3A;输出类型:可调;; LCSC Part Name: 降压型 3A 4.6V~35V; Supplier Part: C7465557; Manufacturer: ETA(钰泰); Supplier Footprint: ESOP-8; JLCPCB Part Class: 扩展库; Datasheet: https://item.szlcsc.com/datasheet/ETA2808E8A/8507094.html; Supplier: LCSC; Function: 降压型; Voltage - Supply: 4.6V~35V; Output Voltage: 800mV~35V; Output Current: 3A; Frequency - Switching: 250kHz；500kHz；300kHz; Operating Temperature: -40℃~+85℃; Synchronous Rectifier: 是; Number of Outputs: 1; Topology: 降压式; Quiescent Current: 500uA; Switch tube (built-in/external): 内置; Output Type: 可调; Features: 轻载高效模式；线缆补偿；逐波限流；可调限流；打嗝限流
U3 = ETA3417S2F: 功能类型:降压型;工作电压:2.6V~7V;输出电压:600mV~7V;输出电流:2.5A;输出类型:可调;; LCSC Part Name: 降压型 2.5A 2.6V~7V; Supplier Part: C7465507; Manufacturer: ETA(钰泰); Supplier Footprint: SOT23-5; JLCPCB Part Class: 扩展库; Datasheet: https://item.szlcsc.com/datasheet/ETA3417S2F/8507044.html; Supplier: LCSC; Function: 降压型; Voltage - Supply: 2.6V~7V; Output Voltage: 600mV~7V; Output Current: 2.5A; Frequency - Switching: 3MHz; Operating Temperature: -40℃~+85℃; Synchronous Rectifier: 是; Number of Outputs: 1; Topology: 降压式; Quiescent Current: 32uA; Switch tube (built-in/external): 内置; Output Type: 可调; Features: 逐波限流；过流保护；EMI优化(抖频模式)

## Nets
AVDD33_PHY0: R21.1 U4.7(AVDD33) U4.30(NC)
AVDD33_PHY1: R37.1 U7.7(AVDD33) U7.30(NC)
DVDD33: C29.1 C30.1 C31.2 C38.1 C39.1 C40.2 R21.2 R23.1 R26.2 R27.2 R37.2 R39.1 R42.2 R43.2 R52.1 R58.1
DVDD33_PHY0: R30.1 U4.14(DVDD33)
DVDD33_PHY1: R46.1 U7.14(DVDD33)
GND: C1.1 C2.1 C3.1 C4.1 C5.2 C8.1 C9.1 C10.1 C11.1 C12.1 C13.1 C15.1 C16.1 C17.1 C18.1 C19.1 C20.1 C21.1 C22.1 C23.1 C24.1 C25.1 C26.1 C27.2 C28.2 C29.2 C30.2 C31.1 C32.1 C33.2 C34.1 C35.1 C36.2 C37.2 C38.2 C39.2 C40.1 C41.1 C42.2 C45.1 C46.1 C48.1 D1.2(A) DC2.2 DC2.3 LED1.2(K) R2.1 R5.1 R6.1 R7.1 R11.1 R20.1 R22.2 R24.2 R29.1 R36.1 R38.2 R40.2 R45.1 R53.1 R59.1 SW1.2 SW2.2 SW3.2 U1.2(GND) U2.9(GND) U3.2(GND) U4.33(EP) U5.8(GND) U6.8(GND) U7.33(EP) X1.2(GND) X1.4(GND) X2.2(GND) X2.4(GND) ; also on sheet 6 7 8 9 10 11 12
PGND: C44.2 C47.2 RJ1.25 RJ1.26 ; also on sheet 8
VCC3V3: C14.2 C15.2 C16.2 C17.2 C32.2 C41.2 L2.2 R9.2 R10.2 R15.2 R16.2 R17.2 R30.2 R46.2 TP4_3V3.1 ; also on sheet 6 7 8 9 11 12
VCC5V: C2.2 C3.2 TP2_5V.1 U1.1(OUT) ; also on sheet 6 9 10
VCC5V_SYS: C1.2 C8.2 C9.2 C10.2 C18.2 C19.2 C132.2 L1.2 R4.2 R13.1 TP3_SYS5V.1 U1.5(IN) U3.4(IN) ; also on sheet 8 11
VCC12V: C4.2 C5.1 C11.2 C12.2 D1.1(C) F1.2 R3.2 TP1.1 U2.2(IN)
VCC_1V8_OUT: M1.65(VCC_1V8_OUT) ; also on sheet 8 10 11 12
VCC_3V3_OUT: M1.66(VCC_3V3_OUT) R1.2 R12.2
4G_RST_H: M1.84(SARADC_IN2/GPIO4_B2_z) ; also on sheet 11
ACODEC_ADC_INN: M1.89(ACODEC_ADC_INN) ; also on sheet 10
ACODEC_ADC_INP: M1.88(ACODEC_ADC_INP) ; also on sheet 10
CAN0_RX: M1.119(RM_IO26/SAI2_LRCK_M1/FLEXBUS1_CSN_M1/FLEXBUS0_D14/FLEXBUS1_D11/DSMC_INT3/VO_LCDC_D16/GPIO1_B3_d) ; also on sheet 6 9
CAN0_TX: M1.118(RM_IO25/SAI2_SCLK_M1/FLEXBUS0_CSN_M1/FLEXBUS0_D15/FLEXBUS1_D10/DSMC_INT2/VO_LCDC_D17/GPIO1_B2_d) ; also on sheet 6 9
CAN1_RX: M1.20(RM_IO18/SPI0_MISO/REF_CLK1_OUT/GPIO0_C2_d) ; also on sheet 6
CAN1_TX: M1.21(RM_IO17/SPI0_MOSI/GPIO0_C1_d) ; also on sheet 6
DSM_AUD_PN: M1.126(DSMC_SLV_DQS0/SAI2_MCLK_M1/FLEXBUS1_CSN_M4/DSM_AUD_RN_M0/FLEXBUS0_CLK/DSMC_D8/VO_LCDC_D10/GPIO1_C1_d)
DSM_AUD_PR: M1.127(DSMC_SLV_D0/RM_IO27/SAI2_SDI_M1/FLEXBUS0_CSN_M5/DSM_AUD_RP_M0/FLEXBUS0_D9/DSMC_D9/VO_LCDC_D9/GPIO1_C2_d)
ETH_RMII0_CLK: M1.74(SPI2_MOSI/ETH_RMII0_CLK/GPIO2_B2_d) R33.2
ETH_RMII0_MDC: M1.62(SAI3_SDI/DSM_AUD_LN_M1/ETH_RMII0_MDC/GPIO2_B6_d) U4.22(MDC)
ETH_RMII0_MDIO: M1.63(SAI3_SDO/DSM_AUD_LP_M1/ETH_RMII0_MDIO/GPIO2_B7_d) U4.23(MDIO)
ETH_RMII0_RSTN: C33.1 M1.19(RM_IO19/SPI0_CSN0/ETH_CLK1_25M_OUT/GPIO0_C3_d) R27.1 U4.21(RESET_N)
ETH_RMII0_RXD0: M1.73(SPI2_CLK/ETH_RMII0_RXD0/GPIO2_B0_d) R25.2
ETH_RMII0_RXD1: M1.72(SPI2_CSN/ETH_RMII0_RXD1/GPIO2_B1_d) R28.2
ETH_RMII0_RXDVCRS: M1.64(SAI3_MCLK /ETH_RMII0_RXDVCRS/GPIO2_C0_d) R22.1 U4.26(CRS/CRS_DV)
ETH_RMII0_TXD0: M1.71(SPI2_MISO/ETH_RMII0_TXD0/GPIO2_B3_d) R34.2
ETH_RMII0_TXD1: M1.70(SAI3_SCLK/DSM_AUD_RN_M1/ETH_RMII0_TXD1/GPIO2_B4_d) R35.2
ETH_RMII0_TXEN: M1.69(SAI3_LRCK/DSM_AUD_RP_M1/ETH_RMII0_TXEN/GPIO2_B5_d) R32.2
ETH_RMII1_CLK: M1.49(ETH_RMII1_CLK/SAI2_SDO_M0/GPIO3_B0_d) R49.2
ETH_RMII1_MDC: M1.47(ETH_RMII1_MDC/UART5_TX_M0/GPIO3_B4_d) U7.22(MDC)
ETH_RMII1_MDIO: M1.46(ETH_RMII1_MDIO/UART5_RTSN_M0/ GPIO3_B5_d) U7.23(MDIO)
ETH_RMII1_RSTN: C42.1 M1.18(RM_IO20/AUPLL_CLK_IN/ETH_CLK0_25M_OUT/GPIO0_C4_d) R43.1 U7.21(RESET_N)
ETH_RMII1_RXD0: M1.54(ETH_RMII1_RXD0/SAI2_SDI_M0/GPIO3_A6_d) R41.2
ETH_RMII1_RXD1: M1.53(ETH_RMII1_RXD1/SAI2_SCLK_M0/GPIO3_A7_d) R44.2
ETH_RMII1_RXDVCRS: M1.45(ETH_RMII1_RXDVCRS/SAI2_MCLK_M0/GPIO3_B6_d) R38.1 U7.26(CRS/CRS_DV)
ETH_RMII1_TXD0: M1.52(ETH_RMII1_TXD0/SAI2_LRCK_M0/GPIO3_B1_d) R50.2
ETH_RMII1_TXD1: M1.51(ETH_RMII1_TXD1/UART5_CTSN_M0/GPIO3_B2_d) R51.2
ETH_RMII1_TXEN: M1.50(ETH_RMII1_TXEN/UART5_RX_M0/GPIO3_B3_d) R48.2
FSPI_CLK: M1.76(NC/FSPI_CLK/GPIO2_A1_d)
FSPI_CSN: M1.81(NC/FSPI_CSN/GPIO2_A0_u)
FSPI_D0: M1.77(NC/FSPI_D0/GPIO2_A2_u)
FSPI_D1: M1.80(NC/FSPI_D1/GPIO2_A3_u)
FSPI_D2: M1.79(NC/FSPI_D2/GPIO2_A4_u)
FSPI_D3: M1.78(NC/FSPI_D3/GPIO2_A5_u)
GPIO1_A0: M1.106(FLEXBUS1_D0/DSMC_CLKP/VO_LCDC_DEN/GPIO1_A0_d) ; also on sheet 9
GPIO1_A1: M1.107(DSMC_SLV_INT/DSMC_INT0/FLEXBUS1_D1/DSMC_CLKN/VO_LCDC_VSYNC/GPIO1_A1_d) ; also on sheet 9
GPIO1_A2: M1.108(FLEXBUS1_D2/DSMC_DQS0/VO_LCDC_HSYNC/GPIO1_A2_d) ; also on sheet 9
GPIO1_A3: M1.109(FLEXBUS1_D3/DSMC_D0/VO_LCDC_CLK /GPIO1_A3_d) ; also on sheet 9
GPIO1_A4: M1.111(FLEXBUS1_D4/DSMC_D1/VO_LCDC_D23/GPIO1_A4_d) ; also on sheet 9
GPIO1_A5: M1.112(FLEXBUS1_D5/DSMC_D2/VO_LCDC_D22/GPIO1_A5_d) ; also on sheet 9
GPIO1_A6: M1.113(FLEXBUS1_D6/DSMC_D3/VO_LCDC_D21/GPIO1_A6_d) ; also on sheet 9
GPIO1_A7: M1.114(FLEXBUS1_D7/DSMC_D4/VO_LCDC_D20/GPIO1_A7_d) ; also on sheet 9
GPIO1_B0: M1.116(FLEXBUS0_CSN_M0/FLEXBUS1_D8/DSMC_D5/VO_LCDC_D19/GPIO1_B0_d) ; also on sheet 9
GPIO1_B4: M1.120(FLEXBUS0_CSN_M2/FLEXBUS0_D13/FLEXBUS1_D12/DSMC_D6/VO_LCDC_D15/GPIO1_B4_d) ; also on sheet 9
GPIO1_B5: M1.121(FLEXBUS1_CSN_M2/FLEXBUS0_D12/FLEXBUS1_D13/DSMC_D7/VO_LCDC_D14/GPIO1_B5_d) ; also on sheet 9
GPIO1_B6: M1.122(FLEXBUS0_CSN_M3/FLEXBUS0_D11/FLEXBUS1_D14/DSMC_CSN0 /VO_LCDC_D13/GPIO1_B6_d) ; also on sheet 9
GPIO1_B7: M1.123(FLEXBUS1_CSN_M3/FLEXBUS0_D10/FLEXBUS1_D15/DSMC_RDYN/VO_LCDC_D12/GPIO1_B7_d) ; also on sheet 9
GPIO1_C0: M1.125(DSMC_SLV_CLK/FLEXBUS0_CSN_M4/DSMC_INT1/FLEXBUS1_CLK/DSMC_RESETN/VO_LCDC_D11/GPIO1_C0_d) ; also on sheet 9
GPIO1_C4: M1.1(DSMC_SLV_D2/FLEXBUS0_D7/DSMC_D11/VO_LCDC_D7/GPIO1_C4_d) ; also on sheet 9
GPIO1_C5: M1.2(DSMC_SLV_D3/FLEXBUS0_D6/DSMC_D12/VO_LCDC_D6/GPIO1_C5_d) ; also on sheet 9
GPIO1_C6: M1.3(DSMC_SLV_D4/FLEXBUS0_D5/DSMC_D13/VO_LCDC_D5/GPIO1_C6_d) ; also on sheet 9
GPIO1_C7: M1.4(DSMC_SLV_D5/FLEXBUS0_D4/DSMC_D14/VO_LCDC_D4/GPIO1_C7_d) ; also on sheet 9
GPIO1_D0: M1.6(DSMC_SLV_D6/DSM_AUD_LN_M0/FLEXBUS0_D3/DSMC_D15/VO_LCDC_D3/GPIO1_D0_d) ; also on sheet 9
I2C_SCL: M1.43(RM_IO0/SAI0_LRCK/GPIO0_A0_u) R15.1 ; also on sheet 7 9 11
I2C_SDA: M1.42(RM_IO1/SAI0_SCLK/GPIO0_A1_d) R16.1 ; also on sheet 7 9 11
LAN0_A+: L3.23(MX1+) RJ1.1
LAN0_A-: L3.22(MX1-) RJ1.2
LAN0_B+: L3.20(MX2+) RJ1.3
LAN0_B-: L3.19(MX2-) RJ1.6
LAN0_LED0: R26.1 RJ1.11 U4.24(LEDO/PHYADDO)
LAN0_LED1: R24.1 RJ1.10 U4.25(LED1/PHYADD1)
LAN0_RXN: L3.6(TD2-) U4.6(TRXN1) U5.5(I/O) U5.6(NC)
LAN0_RXP: L3.5(TD2+) U4.5(TRXP1) U5.4(I/O) U5.7(NC)
LAN0_TXN: L3.3(TD1-) U4.4(TRXNO) U5.2(I/O) U5.9(NC)
LAN0_TXP: L3.2(TD1+) U4.3(TRXPO) U5.1(I/O) U5.10(NC)
LAN1_A+: L3.17(MX3+) RJ1.13
LAN1_A-: L3.16(MX3-) RJ1.14
LAN1_B+: L3.14(MX4+) RJ1.15
LAN1_B-: L3.13(MX4-) RJ1.18
LAN1_LED0: R42.1 RJ1.23 U7.24(LEDO/PHYADDO)
LAN1_LED1: R40.1 RJ1.22 U7.25(LED1/PHYADD1)
LAN1_RXN: L3.12(TD4-) U6.5(I/O) U6.6(NC) U7.6(TRXN1)
LAN1_RXP: L3.11(TD4+) U6.4(I/O) U6.7(NC) U7.5(TRXP1)
LAN1_TXN: L3.9(TD3-) U6.2(I/O) U6.9(NC) U7.4(TRXNO)
LAN1_TXP: L3.8(TD3+) U6.1(I/O) U6.10(NC) U7.3(TRXPO)
LCD_PWM: M1.39(RM_IO4/SAI0_SDI0/GPIO0_A4_d) ; also on sheet 7 9
LCD_PWREN: M1.11(REF_CLK0_OUT/OSC_CLK_OUT/GPIO0_D0_d) ; also on sheet 9
MIPI_DPHY_DSI_TX_CLKN: M1.98(MIPI_DPHY_DSI_TX_CLKN/GPO4_A4_z)
MIPI_DPHY_DSI_TX_CLKP: M1.99(MIPI_DPHY_DSI_TX_CLKP/GPO4_A5_z)
MIPI_DPHY_DSI_TX_D0N: M1.103(MIPI_DPHY_DSI_TX_D0N/GPO4_A0_z)
MIPI_DPHY_DSI_TX_D0P: M1.104(MIPI_DPHY_DSI_TX_D0P/GPO4_A1_z)
MIPI_DPHY_DSI_TX_D1N: M1.101(MIPI_DPHY_DSI_TX_D1N/GPO4_A2_z)
MIPI_DPHY_DSI_TX_D1P: M1.102(MIPI_DPHY_DSI_TX_D1P/GPO4_A3_z)
MIPI_RST_L: M1.26(RM_IO13/SAI1_SDO1/GPIO0_B5_d)
NPOR_L: M1.16(NPOR_L) R8.1 R14.1
SAI1_LRCK: M1.29(RM_IO10/SPI1_MISO/SAI1_LRCK/GPIO0_B2_d)
SAI1_MCLK: M1.31(RM_IO8/SPI1_CLK/SAI1_MCLK/GPIO0_B0_d)
SAI1_SCLK: M1.30(RM_IO9/SPI1_MOSI/SAI1_SCLK/GPIO0_B1_d)
SAI1_SDI: M1.28(RM_IO11/SAI1_SDI/GPIO0_B3_d)
SAI1_SDO0: M1.27(RM_IO12/SAI1_SDO0/GPIO0_B4_d)
SARADC_IN0_BOOT: M1.86(SARADC_IN0_BOOT/GPIO4_B0_z) R19.1 ; also on sheet 11
SARADC_IN1_RECOVERY: M1.85(SARADC_IN1_RECOVERY/GPIO4_B1_z) R18.1
SDMMC_CLK: M1.60(NC/SDMMC_CLK/GPIO3_A0_d) ; also on sheet 12
SDMMC_CMD: M1.59(NC/SDMMC_CMD/GPIO3_A1_d) ; also on sheet 12
SDMMC_D0: M1.57(NC/SDMMC_D0/GPIO3_A2_d) ; also on sheet 12
SDMMC_D1: M1.56(NC/TEST_CLK_OUT/SDMMC_D1/GPIO3_A3_d) ; also on sheet 12
SDMMC_D2: M1.55(NC/JTAG_TCK_M0/SDMMC_D2/GPIO3_A4_d) ; also on sheet 12
SDMMC_D3: M1.58(NC/JTAG_TMS_M0/SDMMC_D3/GPIO3_A5_d) ; also on sheet 12
SDMMC_DET_L: M1.83(SARADC_IN3/GPIO4_B3_z) ; also on sheet 12
SPK_CTRL: M1.25(RM_IO14/SPI1_CSN0/SAI1_SDO2/GPIO0_B6_d) ; also on sheet 10
TP_INT: M1.41(RM_IO2/SAI0_MCLK/GPIO0_A2_u) R17.1 ; also on sheet 7 9
TP_RST: M1.40(RM_IO3/SAI0_SDO/GPIO0_A3_d) ; also on sheet 7 9
UART0_RX_DEBUG: M1.13(RM_IO23/JTAG_TMS_M1/UART0_RX_Debug/GPIO0_C7_u) ; also on sheet 12
UART1_RX: M1.22(RM_IO16/SPI0_CLK/GPIO0_C0_d) ; also on sheet 6
UART1_TX: M1.24(RM_IO15/SPI0_CSN1/SAI1_SDO3/GPIO0_B7_d) ; also on sheet 6
UART2_RX: M1.128(DSMC_SLV_D1/RM_IO28/SAI2_SDO_M1/FLEXBUS1_CSN_M5/FLEXBUS0_D8/DSMC_D10/VO_LCDC_D8/GPIO1_C3_d) ; also on sheet 6 9
UART2_TX: M1.117(RM_IO24/UART5_CTSN_M1/FLEXBUS1_CSN_M0/FLEXBUS1_D9/DSMC_CSN1/VO_LCDC_D18/GPIO1_B1_d) ; also on sheet 9
UART3_RTSN: M1.38(RM_IO5/SAI0_SDI1/GPIO0_A5_d) ; also on sheet 6
UART3_RX: M1.36(RM_IO7/SPI1_CSN1/SAI0_SDI3/GPIO0_A7_d) ; also on sheet 6
UART3_TX: M1.37(RM_IO6/SAI0_SDI2/GPIO0_A6_d) ; also on sheet 6
UART4_RTSN: M1.7(DSMC_SLV_D7/RM_IO29/UART5_RTSN_M1/DSM_AUD_LP_M0/FLEXBUS0_D2/DSMC_DQS1/VO_LCDC_D2/GPIO1_D1_d) ; also on sheet 6 9
UART4_RX: M1.8(DSMC_SLV_CSN0/RM_IO30/UART5_TX_M1/FLEXBUS0_D1/DSMC_CSN2/VO_LCDC_D1/GPIO1_D2_d) ; also on sheet 6 9
UART4_TX: M1.9(DSMC_SLV_RDYN/RM_IO31/UART5_RX_M1/FLEXBUS0_D0/DSMC_CSN3/VO_LCDC_D0/GPIO1_D3_d) ; also on sheet 6 9
UATT0_TX_DEBUG: M1.14(RM_IO22/JTAG_TCK_M1/UART0_TX_Debug/GPIO0_C6_u)
USB20_OTG0_DM: M1.93(USB20_OTG0_DM) ; also on sheet 8
USB20_OTG0_DP: M1.94(USB20_OTG0_DP) ; also on sheet 8
USB20_OTG0_ID: M1.92(USB20_OTG0_ID) ; also on sheet 8
USB20_OTG0_VBUSDET: M1.91(USB20_OTG0_VBUSDET) ; also on sheet 8
USB20_OTG1_DM: M1.95(USB20_OTG1_DM)
USB20_OTG1_DP: M1.96(USB20_OTG1_DP)
$3N170: DC2.1 F1.1
$3N1819: R3.1 R6.2 U2.3(EN)
$3N1909: C13.2 U2.7(LDO)
$3N1991: R5.2 U2.6(OSC)
$3N2188: C132.1 R4.1 R7.2 U2.5(FB)
$3N2283: C6.2 U2.8(BST)
$3N2287: C6.1 L1.1 U2.1(SW)
$3N4434: R1.1 U1.4(EN)
$3N4821: R2.2 U1.3(ILIM)
$3N5404: C14.1 R9.1 R11.2 U3.5(FB)
$3N5408: L2.1 U3.3(SW)
$3N5841: R8.2 U3.1(EN)
$3N6109: LED1.1(A) R10.1
$4N1410: C22.2 M1.68(VCCIO4_IN) R12.1
$4N1633: C20.2 C21.2 M1.34(VCCSYS_IN2) R13.2
$4N1704: C23.2 C24.2 M1.33(VCCSYS_IN1)
$4N1926: R14.2 SW1.1
$4N2066: R18.2 SW2.1
$4N2178: R19.2 SW3.1
$5N364: C26.2 U4.2(AVDDLREG)
$5N400: R29.2 U4.12(RXD3/CLK_CTL)
$5N408: R34.1 U4.16(TXD[0])
$5N412: C25.2 U4.32(XTAL_OUT) X1.3(OSC2)
$5N414: C27.1 U4.31(XTAL_IN) X1.1(OSC1)
$5N442: R35.1 U4.17(TXD[1])
$5N651: R32.1 U4.20(TX_EN)
$5N1462: R33.1 U4.15(TXC)
$5N2204: R20.2 U4.1(RBIAS)
$5N2881: R23.2 U4.8(RX_DV)
$5N2924: R31.1 U4.19(TXD[3])
$5N3506: C28.1 U4.29(DVDDL_REG)
$5N4420: C43.2 L3.1(TCT1)
$5N4728: C45.2 L3.4(TCT2)
$5N4743: C46.2 L3.7(TCT3)
$5N4758: C48.2 L3.10(TCT4)
$5N4975: L3.24(MCT1) R54.1
$5N4989: L3.21(MCT2) R55.1
$5N5185: L3.18(MCT3) R56.1
$5N5200: L3.15(MCT4) R57.1
$5N5218: C44.1 R54.2 R55.2
$5N5594: C47.1 R56.2 R57.2
$5N9162: R51.1 U7.17(TXD[1])
$5N9163: R48.1 U7.20(TX_EN)
$5N9164: R47.1 U7.19(TXD[3])
$5N9166: R49.1 U7.15(TXC)
$5N9168: R50.1 U7.16(TXD[0])
$5N9169: R39.2 U7.8(RX_DV)
$5N9174: C36.1 U7.31(XTAL_IN) X2.1(OSC1)
$5N9233: C37.1 U7.29(DVDDL_REG)
$5N9236: C34.2 U7.32(XTAL_OUT) X2.3(OSC2)
$5N9254: C35.2 U7.2(AVDDLREG)
$5N9255: R36.2 U7.1(RBIAS)
$5N11286: R52.2 RJ1.12
$5N11391: R53.2 RJ1.9
$5N11729: R58.2 RJ1.24
$5N11739: R59.2 RJ1.21
$5N23946: R41.1 U7.9(RXD[0])
$5N23989: R44.1 U7.10(RXD[1])
$5N24066: R28.1 U4.10(RXD[1])
$5N24072: R25.1 U4.9(RXD[0])
$5N24085: R45.2 U7.12(RXD3/CLK_CTL)

Not connected (* = marked no-connect by the designer): C43 1; DC2 4* 5*; M1 5(GND5) 10(GND10) 12(GND12) 15(GND15) 17(GND17) 23(GND23) 32(GND32) 35(GND35) 44(GND44) 48(GND48) 61(GND61) 67(GND67) 75(GND75) 82(GND82) 87(GND87) 90(GND90) 97(GND97) 100(GND100) 105(GND105) 110(GND110) 115(GND115) 124(GND124); R31 2; R47 2; RJ1 4* 5* 7* 8* 16* 17* 19* 20*; SCREW1 1; SCREW2 1; SCREW3 1; SCREW4 1; U2 4(ISET)*; U4 11(RXD[2]/INT_N)* 13(RXC)* 18(TXD[2])* 27(COL)* 28(RX_ER)*; U5 3(GND); U6 3(GND); U7 11(RXD[2]/INT_N)* 13(RXC)* 18(TXD[2])* 27(COL)* 28(RX_ER)*

## Notes on the sheets
sheet 1
- HD588E
- VCC5V
- SIT1051AT/3
- BL13232ETS
- ETA6380S2F
- CH334H
- DC_IN
- ETA28331E8A
- VCC5V_SYS
- SOM3506
- YT8512
- 4.5-35V
- VCC3V3
- ES8388
- ETA3417S2F
- VCC3V3
- ETA6380S2F
- 星闪F73
- VCC3V8
- ETA3417S2F
- ML307R-DC
sheet 2
- ADC
- TF卡
- TYPEC OTG USB2.0
- MIPI_DPHY_DSI_TX
- 30PIN_MIPI_DSI 2Lane
- RMII0
- 100M
- YT8512
- RJ45
- SOM3506
- RMII1
- 100M
- YT8512
- RJ45
- CAN x 2
- SIT1051AT/3
- 4PIN XH2.54
- RS485 x 2
- HD588E
- 4PIN XH2.54
- RS232 x 2
- BL13232ETS
- 4PIN XH2.54
- USB OTG
- CH334
- 星闪F73
- WIFI/BT
- ML307R-DC
- 4G
- 2 x 25 PIN 双排针
- TypeA USB2.0 x 2
- CODEC
- MIC + SPK
- LINEIN LINEOUT
sheet 3
- 外设电源VCC5V
- 系统电源输入4.5V-35V
- 系统电源VCC5V_SYS
- 系统电源VCC3V3
- 底板固定孔 M3 x 4
sheet 4
- 系统复位
- Loader模式
- Markrom模式
sheet 5
- 以太网PHY0
- TVS静电保护
- 以太网PHY1
- 变压器
- RJ45网口
